# Altium project Flight Controller Core.PrjPcb (part 2 of 2)

## Sheet S7_Uart.SchDoc
size 420 x 297 mm; SheetNumber: 7; SheetTotal: 11
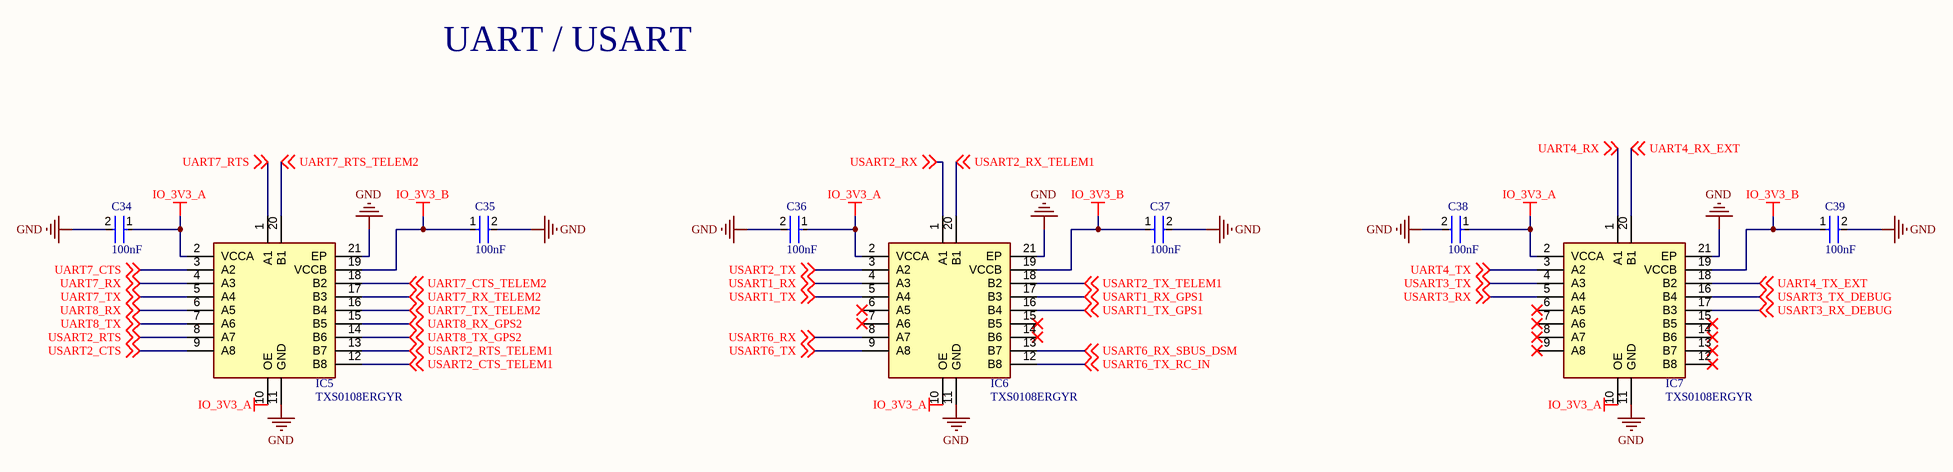
[diagram p6: S7_Uart.SchDoc]

### Parts
C34  100nF  [FP-CC0402-MFG]
C35  100nF  [FP-CC0402-MFG]
C36  100nF  [FP-CC0402-MFG]
C37  100nF  [FP-CC0402-MFG]
C38  100nF  [FP-CC0402-MFG]
C39  100nF  [FP-CC0402-MFG]
IC5  TXS0108ERGYR  [SN74LVC541ARGYR]
IC6  TXS0108ERGYR  [SN74LVC541ARGYR]
IC7  TXS0108ERGYR  [SN74LVC541ARGYR]

### Nets
GND: C34.2 C35.2 C36.2 C37.2 C38.2 C39.2 IC5.11(GND) IC5.21(EP) IC6.11(GND) IC6.21(EP) IC7.11(GND) IC7.21(EP)
IO_3V3_A: C34.1 C36.1 C38.1 IC5.2(VCCA) IC5.10(OE) IC6.2(VCCA) IC6.10(OE) IC7.2(VCCA) IC7.10(OE)
IO_3V3_B: C35.1 C37.1 C39.1 IC5.19(VCCB) IC6.19(VCCB) IC7.19(VCCB)
UART4_RX: IC7.1(A1) ; off-sheet UART4_RX
UART4_RX_EXT: IC7.20(B1) ; off-sheet UART4_RX_EXT
UART4_TX: IC7.3(A2) ; off-sheet UART4_TX
UART4_TX_EXT: IC7.18(B2) ; off-sheet UART4_TX_EXT
UART7_CTS: IC5.3(A2) ; off-sheet UART7_CTS
UART7_CTS_TELEM2: IC5.18(B2) ; off-sheet UART7_CTS_TELEM2
UART7_RTS: IC5.1(A1) ; off-sheet UART7_RTS
UART7_RTS_TELEM2: IC5.20(B1) ; off-sheet UART7_RTS_TELEM2
UART7_RX: IC5.4(A3) ; off-sheet UART7_RX
UART7_RX_TELEM2: IC5.17(B3) ; off-sheet UART7_RX_TELEM2
UART7_TX: IC5.5(A4) ; off-sheet UART7_TX
UART7_TX_TELEM2: IC5.16(B4) ; off-sheet UART7_TX_TELEM2
UART8_RX: IC5.6(A5) ; off-sheet UART8_RX
UART8_RX_GPS2: IC5.15(B5) ; off-sheet UART8_RX_GPS2
UART8_TX: IC5.7(A6) ; off-sheet UART8_TX
UART8_TX_GPS2: IC5.14(B6) ; off-sheet UART8_TX_GPS2
USART1_RX: IC6.4(A3) ; off-sheet USART1_RX
USART1_RX_GPS1: IC6.17(B3) ; off-sheet USART1_RX_GPS1
USART1_TX: IC6.5(A4) ; off-sheet USART1_TX
USART1_TX_GPS1: IC6.16(B4) ; off-sheet USART1_TX_GPS1
USART2_CTS: IC5.9(A8) ; off-sheet USART2_CTS
USART2_CTS_TELEM1: IC5.12(B8) ; off-sheet USART2_CTS_TELEM1
USART2_RTS: IC5.8(A7) ; off-sheet USART2_RTS
USART2_RTS_TELEM1: IC5.13(B7) ; off-sheet USART2_RTS_TELEM1
USART2_RX: IC6.1(A1) ; off-sheet USART2_RX
USART2_RX_TELEM1: IC6.20(B1) ; off-sheet USART2_RX_TELEM1
USART2_TX: IC6.3(A2) ; off-sheet USART2_TX
USART2_TX_TELEM1: IC6.18(B2) ; off-sheet USART2_TX_TELEM1
USART3_RX: IC7.5(A4) ; off-sheet USART3_RX
USART3_RX_DEBUG: IC7.17(B3) ; off-sheet USART3_RX_DEBUG
USART3_TX: IC7.4(A3) ; off-sheet USART3_TX
USART3_TX_DEBUG: IC7.16(B4) ; off-sheet USART3_TX_DEBUG
USART6_RX: IC6.8(A7) ; off-sheet USART6_RX
USART6_RX_SBUS_DSM: IC6.13(B7) ; off-sheet USART6_RX_SBUS_DSM
USART6_TX: IC6.9(A8) ; off-sheet USART6_TX
USART6_TX_RC_IN: IC6.12(B8) ; off-sheet USART6_TX_RC_IN

Not connected (* = marked no-connect by the designer): IC6 6(A5)* 7(A6)* 14(B6)* 15(B5)*; IC7 6(A5)* 7(A6)* 8(A7)* 9(A8)* 12(B8)* 13(B7)* 14(B6)* 15(B5)*

### Notes on the sheet
- UART / USART
- THIS DOCUMENT AND THE DATA DISCLOSED HEREIN OR
- HEREWITH IS THE PROPERTY OF ALTIUM LIMITED AND MAY
- DWG NO:
- REVISION
- REV:
- DESCRIPTION
- DATE
- APPROVED
- BE FREELY DISTRIBUTED IN WHOLE. NO RIGHTS ARE
- RESERVED OR EXPRESS OR IMPLIED WARANTEE GIVEN.
- ENG:
- APPROVALS
- PROJECT
- DSN:
- CHK:
- REFERENCE DOCUMENTS
- PROJECT REVISION:
- TITLE
- DOCUMENT REVISION:
- DESIGN ITEM:
- BOM:
- FAB DWG:
- PCB DWG:
- ASSY DWG:
- SCALE:
- A3
- SIZE
- CAGE CODE
- FILE NAME
- DWG NO.
- SHEET
- OF
- REV

### Library data of the parts
C34-C39 = CMP-03422-001121-1: CAP CER 0.1UF 16V X7R 0402; Manufacturer: YAGEO; Manufacturer Part Number: CC0402KPX7R7BB104; Material: Ceramic; Temperature Coefficient: 30ppm/°C; Automotive Grade: NA; Tolerance: 0.1; Digikey Description: CAP CER 0.1UF 16V X7R 0402; Temperature Range Low: -55°C; Footprint Url: http://www.yageo.com/exep/pages/download/literatures/UPY-C_GEN_24.pdf; RoHS: TRUE; Device Class L3: Ceramic Capacitors; Temperature Characteristic: X7R; Capacitance: 100 nF; Package: CC0402; Device Class L1: Passive Components; Lead Free: Yes; Temperature Range High: +125°C; Category: Cap; Mouser Description: 0402 0.1 uF 16 V ±10% Tolerance X7R SMT Multilayer Ceramic Capacitor; Voltage Rating: 16 V; Value: 100 nF; ComponentLink2Description: Datasheet; Automotive: No; Octopart: https://octopart.com/cc0402kpx7r7bb104-yageo-21548559; ComponentLink2URL: http://www.yageo.com/documents/recent/UPY-GP_NP0_16V-to-50V_16.pdf; Height: 0.55mm; Device Class L2: Capacitors; Temperature: -55°C to +125°C; Ipc Land Pattern Name: CAPC10050X50
IC5-IC7 = TXS0108ERGYR: Integrated Circuit; Manufacturer_Name: Texas Instruments; Datasheet Link: http://www.ti.com/lit/gpn/txs0108e; Height: 1mm; Manufacturer_Part_Number: TXS0108ERGYR; Mouser Part Number: 595-TXS0108ERGYR; Mouser Price/Stock: https://www.mouser.co.uk/ProductDetail/Texas-Instruments/TXS0108ERGYR?qs=dqESbKqT1jau1kZv8JPj9Q%3D%3D; Arrow Part Number: TXS0108ERGYR; Arrow Price/Stock: https://www.arrow.com/en/products/txs0108ergyr/texas-instruments?utm_currency=USD&region=nac

## Sheet S8_Usb_Select.SchDoc
size 420 x 297 mm; SheetNumber: 8; SheetTotal: 11
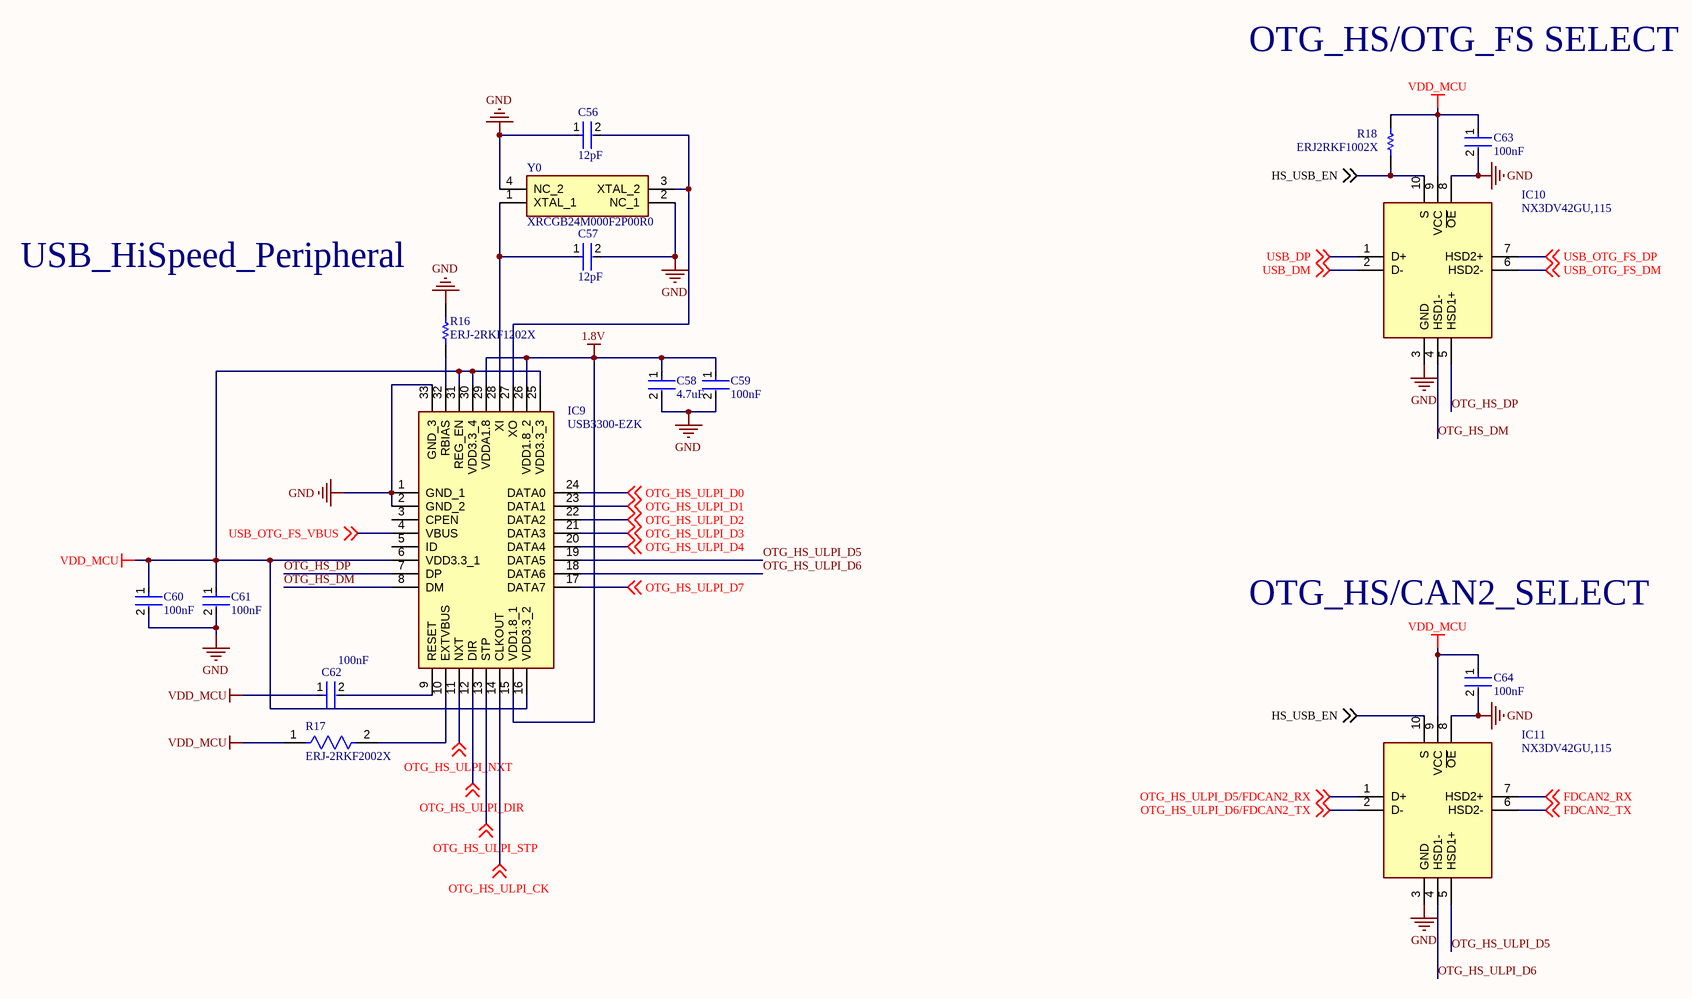
[diagram p7: S8_Usb_Select.SchDoc]

### Parts
C56  12pF  [FP-GRM155-0_05-MFG]
C57  12pF  [FP-GRM155-0_05-MFG]
C58  4.7uF  [FP-CC0402-MFG]
C59  100nF  [FP-CC0402-MFG]
C60  100nF  [FP-CC0402-MFG]
C61  100nF  [FP-CC0402-MFG]
C62  100nF  [FP-CC0402-MFG]
C63  100nF  [FP-CC0402-MFG]
C64  100nF  [FP-CC0402-MFG]
IC9  USB3300-EZK  [QFN50P500X500X100-33N-D]
IC10  NX3DV42GU,115  [QFN40P140X180X50-10N]
IC11  NX3DV42GU,115  [QFN40P140X180X50-10N]
R16  ERJ-2RKF1202X  [RESC1005X40X25ML05T05]
R17  ERJ-2RKF2002X  [FP-ERJ2RK-MFG]
R18  ERJ2RKF1002X  [RESC1005X40X25LL05T05]
Y0  XRCGB24M000F2P00R0  [XRCGB]

### Nets
1.8V: C58.1 C59.1 IC9.15(VDD1.8_1) IC9.26(VDD1.8_2) IC9.29(VDDA1.8)
GND: C56.1 C57.2 C58.2 C59.2 C60.2 C61.2 C63.2 C64.2 IC9.1(GND_1) IC9.2(GND_2) IC9.33(GND_3) IC10.3(GND) IC10.8(~{OE}) IC11.3(GND) IC11.8(~{OE}) R16.2 Y0.2(NC_1) Y0.4(NC_2)
VDD_MCU: C60.1 C61.1 C62.1 C63.1 C64.1 IC9.6(VDD3.3_1) IC9.16(VDD3.3_2) IC9.25(VDD3.3_3) IC9.30(VDD3.3_4) IC9.31(REG_EN) IC10.9(VCC) IC11.9(VCC) R17.1 R18.2
FDCAN2_RX: IC11.7(HSD2+) ; off-sheet FDCAN2_RX
FDCAN2_TX: IC11.6(HSD2-) ; off-sheet FDCAN2_TX
HS_USB_EN: IC10.10(S) IC11.10(S) R18.1 ; off-sheet HS_USB_EN
OTG_HS_DM: IC9.8(DM) IC10.4(HSD1-)
OTG_HS_DP: IC9.7(DP) IC10.5(HSD1+)
OTG_HS_ULPI_CK: IC9.14(CLKOUT) ; off-sheet OTG_HS_ULPI_CK
OTG_HS_ULPI_D0: IC9.24(DATA0) ; off-sheet OTG_HS_ULPI_D0
OTG_HS_ULPI_D1: IC9.23(DATA1) ; off-sheet OTG_HS_ULPI_D1
OTG_HS_ULPI_D2: IC9.22(DATA2) ; off-sheet OTG_HS_ULPI_D2
OTG_HS_ULPI_D3: IC9.21(DATA3) ; off-sheet OTG_HS_ULPI_D3
OTG_HS_ULPI_D4: IC9.20(DATA4) ; off-sheet OTG_HS_ULPI_D4
OTG_HS_ULPI_D5: IC9.19(DATA5) IC11.5(HSD1+)
OTG_HS_ULPI_D5/FDCAN2_RX: IC11.1(D+) ; off-sheet OTG_HS_ULPI_D5/FDCAN2_RX
OTG_HS_ULPI_D6: IC9.18(DATA6) IC11.4(HSD1-)
OTG_HS_ULPI_D6/FDCAN2_TX: IC11.2(D-) ; off-sheet OTG_HS_ULPI_D6/FDCAN2_TX
OTG_HS_ULPI_D7: IC9.17(DATA7) ; off-sheet OTG_HS_ULPI_D7
OTG_HS_ULPI_DIR: IC9.12(DIR) ; off-sheet OTG_HS_ULPI_DIR
OTG_HS_ULPI_NXT: IC9.11(NXT) ; off-sheet OTG_HS_ULPI_NXT
OTG_HS_ULPI_STP: IC9.13(STP) ; off-sheet OTG_HS_ULPI_STP
USB_DM: IC10.2(D-) ; off-sheet USB_DM
USB_DP: IC10.1(D+) ; off-sheet USB_DP
USB_OTG_FS_DM: IC10.6(HSD2-) ; off-sheet USB_OTG_FS_DM
USB_OTG_FS_DP: IC10.7(HSD2+) ; off-sheet USB_OTG_FS_DP
USB_OTG_FS_VBUS: IC9.4(VBUS) ; off-sheet USB_OTG_FS_VBUS
NetC56_2: C56.2 IC9.27(XO) Y0.3(XTAL_2)
NetC57_1: C57.1 IC9.28(XI) Y0.1(XTAL_1)
NetC62_2: C62.2 IC9.9(RESET)
NetIC9_10: IC9.10(EXTVBUS) R17.2
NetIC9_32: IC9.32(RBIAS) R16.1

Not connected (* = marked no-connect by the designer): IC9 3(CPEN) 5(ID)

### Notes on the sheet
- OTG_HS/OTG_FS SELECT
- (near R16) USB_HiSpeed_Peripheral
- OTG_HS/CAN2_SELECT
- THIS DOCUMENT AND THE DATA DISCLOSED HEREIN OR
- HEREWITH IS THE PROPERTY OF ALTIUM LIMITED AND MAY
- DWG NO:
- REVISION
- REV:
- DESCRIPTION
- DATE
- APPROVED
- BE FREELY DISTRIBUTED IN WHOLE. NO RIGHTS ARE
- RESERVED OR EXPRESS OR IMPLIED WARANTEE GIVEN.
- ENG:
- APPROVALS
- PROJECT
- DSN:
- CHK:
- REFERENCE DOCUMENTS
- PROJECT REVISION:
- TITLE
- DOCUMENT REVISION:
- DESIGN ITEM:
- BOM:
- FAB DWG:
- PCB DWG:
- ASSY DWG:
- SCALE:
- A3
- SIZE
- CAGE CODE
- FILE NAME
- DWG NO.
- SHEET
- OF
- REV

### Library data of the parts
C56 C57 = CMP-2008-03945-2: CAP CER 12PF 50V C0G/NP0 0402; Tolerance: 2%; Dielectric: C0G; Material: Ceramic; Termination: SMD/SMT; Mount: Surface Mount; REACH SVHC: No SVHC; Depth: 0.5mm; Case Code (Metric): 1005; Voltage Rating: 50V; Height: 0.5mm; Voltage Rating (DC): 50V; Case Code (Imperial): 0402; Package Quantity: 10000; Construction: Flat; Thickness: 0.022inch; Length: 1mm; Min Operating Temperature: -55°C; Width: 0.5mm; Lead Free: Lead Free; Capacitance: 12pF; Case/Package: 0402; Packaging: Tape and Reel; Series: GRM; Voltage: 50V; Radiation Hardening: No; Max Operating Temperature: 125°C
C58 = CMP-1034-02137-2: CAP CER 4.7UF 6.3V X5R 0402; Manufacturer: YAGEO; Manufacturer Part Number: CC0402MRX5R5BB475; Temperature Coefficient: 30ppm/°C; Tolerance: 0.2; Automotive Grade: NA; Material: Ceramic; Automotive: No; Temperature: -55°C to +125°C; Category: Cap; Ipc Land Pattern Name: CAPC10050X50; Digikey Description: CAP CER 4.7UF 6.3V X5R 0402; ComponentLink2Description: Datasheet; Octopart: https://octopart.com/cc0402mrx5r5bb475-yageo-20021081; Mouser Description: Multilayer Ceramic Capacitors MLCC - SMD/SMT 4.7uF 6.3V X5R 20%; Device Class L1: Passive Components; Footprint Url: http://www.yageo.com/exep/pages/download/literatures/UPY-C_GEN_24.pdf; Value: 4.7 uF; Temperature Range High: +125°C; ComponentLink2URL: http://www.yageo.com/documents/recent/UPY-GP_NP0_16V-to-50V_16.pdf; Voltage Rating: 6.3 V; Height: 0.55mm; RoHS: TRUE; Package: CC0402; Device Class L3: Ceramic Capacitors; Temperature Characteristic: X5R; Temperature Range Low: -55°C; Capacitance: 4.7 uF; Device Class L2: Capacitors; Lead Free: Yes
C59-C64 = CMP-03422-001121-1: as C34 on sheet S7_Uart; Digikey Description: CAP CER 0.1UF 16V X7R 0402; Temperature Range Low: -55°C; Footprint Url: http://www.yageo.com/exep/pages/download/literatures/UPY-C_GEN_24.pdf; RoHS: TRUE; Device Class L3: Ceramic Capacitors; Temperature Characteristic: X7R; Capacitance: 100 nF; Package: CC0402; Device Class L1: Passive Components; Lead Free: Yes; Temperature Range High: +125°C; Category: Cap; Mouser Description: 0402 0.1 uF 16 V ±10% Tolerance X7R SMT Multilayer Ceramic Capacitor; Voltage Rating: 16 V; Value: 100 nF; ComponentLink2Description: Datasheet; Automotive: No; Octopart: https://octopart.com/cc0402kpx7r7bb104-yageo-21548559; ComponentLink2URL: http://www.yageo.com/documents/recent/UPY-GP_NP0_16V-to-50V_16.pdf; Height: 0.55mm; Device Class L2: Capacitors; Temperature: -55°C to +125°C; Ipc Land Pattern Name: CAPC10050X50
IC9 = USB3300-EZK: Integrated Circuit; Manufacturer_Name: Microchip; Datasheet Link: http://www.microchip.com/mymicrochip/filehandler.aspx?ddocname=en562663; Height: 1mm; Manufacturer_Part_Number: USB3300-EZK; Mouser Part Number: 886-USB3300-EZK; Mouser Price/Stock: https://www.mouser.co.uk/ProductDetail/Microchip-Technology/USB3300-EZK?qs=pA5MXup5wxFkdKvPjm4n2w%3D%3D; Arrow Part Number: USB3300-EZK; Arrow Price/Stock: https://www.arrow.com/en/products/usb3300-ezk/microchip-technology?region=europe
IC10 IC11 = NX3DV42GU,115: Integrated Circuit; Manufacturer_Name: NXP; Datasheet Link: http://www.nxp.com/docs/en/data-sheet/NX3DV42.pdf; Height: 0.5mm; Manufacturer_Part_Number: NX3DV42GU,115; Mouser Part Number: 771-NX3DV42GU115; Mouser Price/Stock: https://www.mouser.co.uk/ProductDetail/NXP-Semiconductors/NX3DV42GU115?qs=cbprxTG2Yq%252BinzuyAklGVQ%3D%3D; Arrow Part Number: NX3DV42GU,115; Arrow Price/Stock: https://www.arrow.com/en/products/nx3dv42gu115/nxp-semiconductors?region=nac
R16 = CMP-2002-00646-4: Chip Resistor, 12 KOhm, +/- 1%, 0.1 W, -55 to 155 degC, 0402 (1005 Metric), RoHS, Tape and Reel; Resistance: 12 KOhm; Voltage Rating: 50 V; Case\/Package: 0402; Power Rating: 100 mW; Length: 1 mm; PackageReference: 0402; DatasheetVersion: 04/2015; ComponentLink2Description: Datasheet; ComponentLink1URL: http://www.panasonic.com/; Pins: 2; Width: 0.5 mm; REACH SVHC: Yes; Packaging: Tape and Reel; Min Operating Temperature: -55 degC; Mounting Technology: Surface Mount; Max Operating Temperature: 155 degC; Case Code (Imperial): 0402; Height: 0.35 mm; Tolerance: 1%; PackageDescription: 2-Pin Surface Mount Device, Body 1 x 0.5 mm; RoHSCompliant: true; ComponentLink1Description: Manufacturer URL; Mount: Surface Mount; ComponentLink2URL: http://industrial.panasonic.com/cdbs/www-data/pdf/RDA0000/AOA0000C86.pdf; Package Quantity: 10000; Case Code (Metric): 1005; PartNumber: ERJ-2RKF1202X
R17 = CMP-2002-00759-4: RES SMD 20K OHM 1% 1/10W 0402; Resistance: 20kR; Voltage Rating (DC): 50V; Power Rating: 100mW; Temperature Coefficient: 100ppm/°C; Radiation Hardening: No; Case/Package: 0402; Case Code (Metric): 1005; Min Operating Temperature: -55°C; Termination: SMD/SMT; Package Quantity: 1; Length: 1mm; Case Code (Imperial): 0402; Lead Free: Lead Free; Height: 0.35mm; Max Operating Temperature: 155°C; Depth: 0.5mm; Number of Terminations: 2; Military Standard: Not; Max Power Dissipation: 100mW; Tolerance: 1%; Composition: Thick Film; Weight: 2.8E-05oz; Features: Automotive AEC-Q200; Voltage Rating: 50V; Contact Plating: Tin; REACH SVHC: No SVHC; Width: 0.02inch; Packaging: Cut Tape; Mount: Surface Mount
R18 = CMP-2000-07588-1: Chip Resistor, 10 KOhm, +/- 1%, 0.1 W, -55 to 155 degC, 0402 (1005 Metric), RoHS, Tape and Reel; Manufacturer: Panasonic; Power Rating: 100mW; Voltage Rating: 50V; Resistance: 10KOhm; Case\/Package: 0402; Temperature Coefficient: 100ppm\/degreesC; RoHSCompliant: True; Lead Free: LeadFree; Package Quantity: 1; Contact Plating: Tin; Length: 1mm; Radiation Hardening: No; REACH SVHC: NoSVHC; Max Operating Temperature: 155degC; Depth: 0.5mm; Case Code (Imperial): 0402; Military Standard: Not; Package Description: 2-Pin Surface Mount Device, Body 1 x 0.5 mm; Termination: SMD/SMT; Case Code (Metric): 1005; Height: 0.35mm; Packaging: TapeandReel; Voltage Rating (DC): 50V; Package Reference: 402; Number of Pins: 2; Tolerance: 1%; Mounting Technology: SurfaceMount; Width: 0.02inch; Mount: SurfaceMount; Datasheet URL: https://industrial.panasonic.com/cdbs/www-data/pdf/RDA0000/AOA0000C304.pdf; Composition: ThickFilm; Datasheet Version: 02/2017; Manufacturer URL: http://www.panasonic.com/; Max Power Dissipation: 100mW; Number of Terminations: 2; Min Operating Temperature: -55degC
Y0 = XRCGB24M000F2P00R0: Crystal or Oscillator; Manufacturer_Name: Murata Electronics; Datasheet Link: https://www.murata.com/products/productdata/8801057734686/SPEC-XRCGB24M000F2P00R0.pdf; Height: 0.7mm; Manufacturer_Part_Number: XRCGB24M000F2P00R0; Mouser Part Number: 81-XRCGB24M000F2P0R0; Mouser Price/Stock: https://www.mouser.co.uk/ProductDetail/Murata-Electronics/XRCGB24M000F2P00R0?qs=gvhpkjpQEVQGHd411wA%252BwA%3D%3D; Arrow Part Number: XRCGB24M000F2P00R0; Arrow Price/Stock: https://www.arrow.com/en/products/xrcgb24m000f2p00r0/murata-manufacturing?region=nac

## Sheet S9_Can.SchDoc
size 420 x 297 mm; SheetNumber: 9; SheetTotal: 11
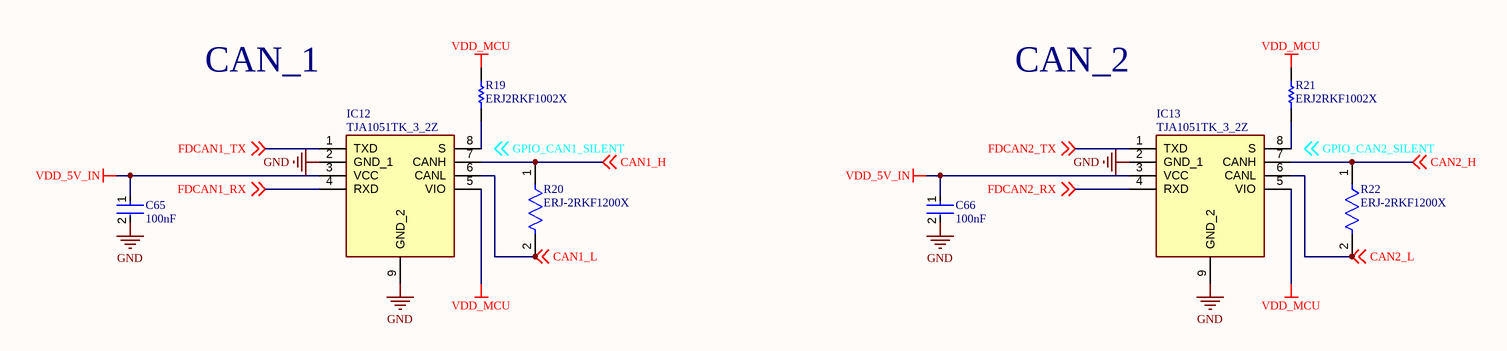
[diagram p8: S9_Can.SchDoc]

### Parts
C65  100nF  [FP-CC0402-MFG]
C66  100nF  [FP-CC0402-MFG]
IC12  TJA1051TK_3_2Z  [SON65P300X300X100-9N-D]
IC13  TJA1051TK_3_2Z  [SON65P300X300X100-9N-D]
R19  ERJ2RKF1002X  [RESC1005X40X25LL05T05]
R20  ERJ-2RKF1200X  [FP-ERJ2RK-MFG]
R21  ERJ2RKF1002X  [RESC1005X40X25LL05T05]
R22  ERJ-2RKF1200X  [FP-ERJ2RK-MFG]

### Nets
GND: C65.2 C66.2 IC12.2(GND_1) IC12.9(GND_2) IC13.2(GND_1) IC13.9(GND_2)
VDD_5V_IN: C65.1 C66.1 IC12.3(VCC) IC13.3(VCC)
VDD_MCU: IC12.5(VIO) IC13.5(VIO) R19.2 R21.2
CAN1_H: IC12.7(CANH) R20.1 ; off-sheet CAN1_H
CAN1_L: IC12.6(CANL) R20.2 ; off-sheet CAN1_L
CAN2_H: IC13.7(CANH) R22.1 ; off-sheet CAN2_H
CAN2_L: IC13.6(CANL) R22.2 ; off-sheet CAN2_L
FDCAN1_RX: IC12.4(RXD) ; off-sheet FDCAN1_RX
FDCAN1_TX: IC12.1(TXD) ; off-sheet FDCAN1_TX
FDCAN2_RX: IC13.4(RXD) ; off-sheet FDCAN2_RX
FDCAN2_TX: IC13.1(TXD) ; off-sheet FDCAN2_TX
NetIC12_8: IC12.8(S) R19.1
NetIC13_8: IC13.8(S) R21.1

### Notes on the sheet
- CAN_1
- CAN_2
- Labels drawn without touching a wire or pin: GPIO_CAN1_SILENT, GPIO_CAN2_SILENT
- THIS DOCUMENT AND THE DATA DISCLOSED HEREIN OR
- HEREWITH IS THE PROPERTY OF ALTIUM LIMITED AND MAY
- DWG NO:
- REVISION
- REV:
- DESCRIPTION
- DATE
- APPROVED
- BE FREELY DISTRIBUTED IN WHOLE. NO RIGHTS ARE
- RESERVED OR EXPRESS OR IMPLIED WARANTEE GIVEN.
- ENG:
- APPROVALS
- PROJECT
- DSN:
- CHK:
- REFERENCE DOCUMENTS
- PROJECT REVISION:
- TITLE
- DOCUMENT REVISION:
- DESIGN ITEM:
- BOM:
- FAB DWG:
- PCB DWG:
- ASSY DWG:
- SCALE:
- A3
- SIZE
- CAGE CODE
- FILE NAME
- DWG NO.
- SHEET
- OF
- REV

### Library data of the parts
C65 C66 = CMP-03422-001121-1: as C34 on sheet S7_Uart; Digikey Description: CAP CER 0.1UF 16V X7R 0402; Temperature Range Low: -55°C; Footprint Url: http://www.yageo.com/exep/pages/download/literatures/UPY-C_GEN_24.pdf; RoHS: TRUE; Device Class L3: Ceramic Capacitors; Temperature Characteristic: X7R; Capacitance: 100 nF; Package: CC0402; Device Class L1: Passive Components; Lead Free: Yes; Temperature Range High: +125°C; Category: Cap; Mouser Description: 0402 0.1 uF 16 V ±10% Tolerance X7R SMT Multilayer Ceramic Capacitor; Voltage Rating: 16 V; Value: 100 nF; ComponentLink2Description: Datasheet; Automotive: No; Octopart: https://octopart.com/cc0402kpx7r7bb104-yageo-21548559; ComponentLink2URL: http://www.yageo.com/documents/recent/UPY-GP_NP0_16V-to-50V_16.pdf; Height: 0.55mm; Device Class L2: Capacitors; Temperature: -55°C to +125°C; Ipc Land Pattern Name: CAPC10050X50
IC12 IC13 = TJA1051TK_3: Integrated Circuit; Manufacturer_Name: NXP; Manufacturer_Part_Number: TJA1051TK/3; Datasheet Link: https://www.nxp.com/docs/en/data-sheet/TJA1051.pdf; Height: 1mm; Mouser Part Number: N/A; Mouser Price/Stock: https://www.mouser.co.uk/ProductDetail/NXP-Semiconductors/TJA1051TK-3?qs=fAHHVMwC%252BbjHKozSeK7tBA%3D%3D
R19 R21 = CMP-2000-07588-1: as R18 on sheet S8_Usb_Select; RoHSCompliant: True; Lead Free: LeadFree; Package Quantity: 1; Contact Plating: Tin; Length: 1mm; Radiation Hardening: No; REACH SVHC: NoSVHC; Max Operating Temperature: 155degC; Depth: 0.5mm; Case Code (Imperial): 0402; Military Standard: Not; Package Description: 2-Pin Surface Mount Device, Body 1 x 0.5 mm; Termination: SMD/SMT; Case Code (Metric): 1005; Height: 0.35mm; Packaging: TapeandReel; Voltage Rating (DC): 50V; Package Reference: 402; Number of Pins: 2; Tolerance: 1%; Mounting Technology: SurfaceMount; Width: 0.02inch; Mount: SurfaceMount; Datasheet URL: https://industrial.panasonic.com/cdbs/www-data/pdf/RDA0000/AOA0000C304.pdf; Composition: ThickFilm; Datasheet Version: 02/2017; Manufacturer URL: http://www.panasonic.com/; Max Power Dissipation: 100mW; Number of Terminations: 2; Min Operating Temperature: -55degC
R20 R22 = CMP-2002-00645-2: RES SMD 120 OHM 1% 1/10W 0402; Resistance: 120R; Voltage Rating (DC): 50V; Temperature Coefficient: 100ppm/°C; Power Rating: 100mW; Case Code (Imperial): 0402; Military Standard: Not; Width: 0.5mm; Technology: THICK FILM; Case Code (Metric): 1005; Lead Free: Lead Free; Radiation Hardening: No; Termination: SMD/SMT; Weight: 0.000388oz; Case/Package: 0402; Resistor Type: Thick Film; Number of Pins: 2; Package Quantity: 10000; Tolerance: 1%; Depth: 0.5mm; RoHS Compliant: Yes; Min Operating Temperature: -55°C; Max Operating Temperature: 155°C; Length: 1mm; Series: ERJ-2Rx; Height: 0.35mm; Mount: Surface Mount; Number of Terminations: 2; Features: Automotive AEC-Q200; Contact Plating: Tin; Voltage Rating: 50V; Max Power Dissipation: 100mW; Packaging: Cut Tape; REACH SVHC: No SVHC

## Sheet S10_Adc.SchDoc
size 420 x 297 mm; SheetNumber: 10; SheetTotal: 12
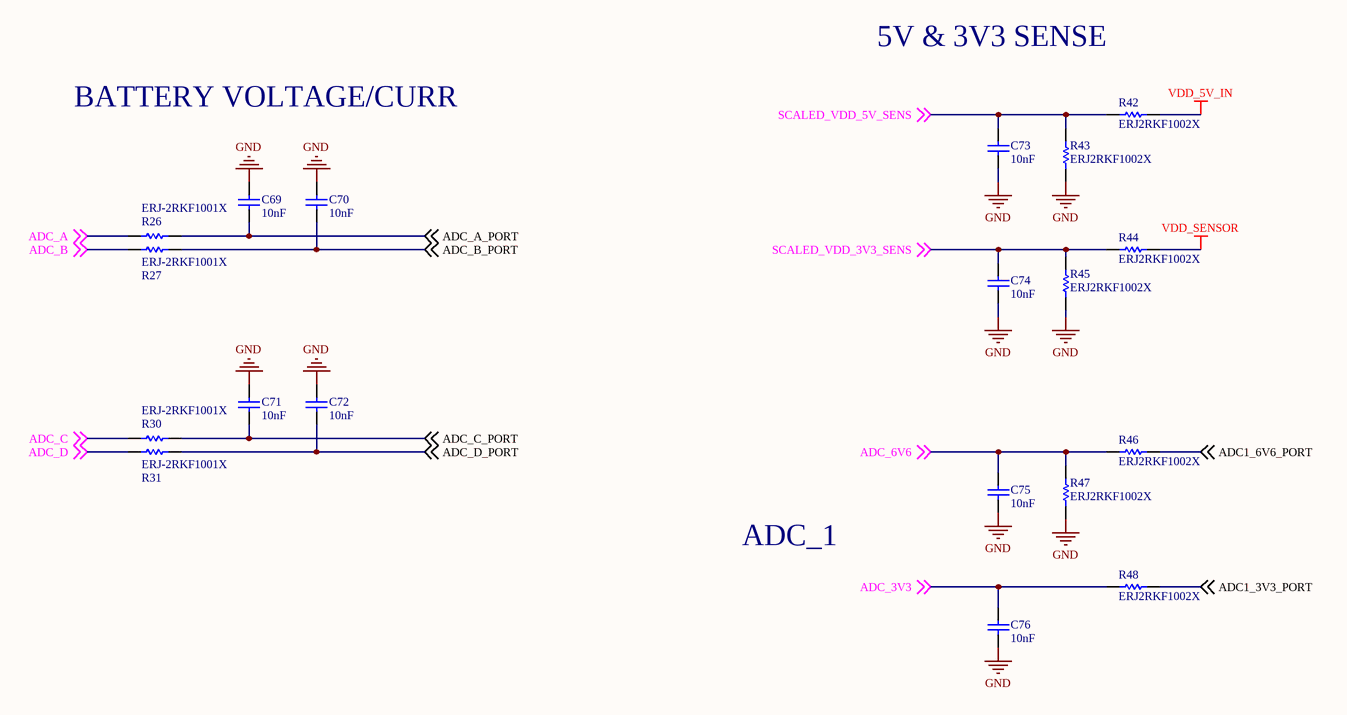
[diagram p9: S10_Adc.SchDoc]

### Parts
C69  10nF  [CAPC1005X55X25LL05T10]
C70  10nF  [CAPC1005X55X25LL05T10]
C71  10nF  [CAPC1005X55X25LL05T10]
C72  10nF  [CAPC1005X55X25LL05T10]
C73  10nF  [CAPC1005X55X25LL05T10]
C74  10nF  [CAPC1005X55X25LL05T10]
C75  10nF  [CAPC1005X55X25LL05T10]
C76  10nF  [CAPC1005X55X25LL05T10]
R26  ERJ-2RKF1001X  [RESC1005X40X25NL05T05]
R27  ERJ-2RKF1001X  [RESC1005X40X25NL05T05]
R30  ERJ-2RKF1001X  [RESC1005X40X25NL05T05]
R31  ERJ-2RKF1001X  [RESC1005X40X25NL05T05]
R42  ERJ2RKF1002X  [RESC1005X40X25LL05T05]
R43  ERJ2RKF1002X  [RESC1005X40X25LL05T05]
R44  ERJ2RKF1002X  [RESC1005X40X25LL05T05]
R45  ERJ2RKF1002X  [RESC1005X40X25LL05T05]
R46  ERJ2RKF1002X  [RESC1005X40X25LL05T05]
R47  ERJ2RKF1002X  [RESC1005X40X25LL05T05]
R48  ERJ2RKF1002X  [RESC1005X40X25LL05T05]

### Nets
GND: C69.2 C70.2 C71.2 C72.2 C73.1 C74.1 C75.1 C76.1 R43.1 R45.1 R47.1
VDD_5V_IN: R42.2
VDD_SENSOR: R44.2
ADC1_3V3_PORT: R48.2 ; off-sheet ADC1_3V3_PORT
ADC1_6V6_PORT: R46.2 ; off-sheet ADC1_6V6_PORT
ADC_3V3: C76.2 R48.1 ; off-sheet ADC_3V3
ADC_6V6: C75.2 R46.1 R47.2 ; off-sheet ADC_6V6
ADC_A: R26.1 ; off-sheet ADC_A
ADC_A_PORT: C69.1 R26.2 ; off-sheet ADC_A_PORT
ADC_B: R27.1 ; off-sheet ADC_B
ADC_B_PORT: C70.1 R27.2 ; off-sheet ADC_B_PORT
ADC_C: R30.1 ; off-sheet ADC_C
ADC_C_PORT: C71.1 R30.2 ; off-sheet ADC_C_PORT
ADC_D: R31.1 ; off-sheet ADC_D
ADC_D_PORT: C72.1 R31.2 ; off-sheet ADC_D_PORT
SCALED_VDD_3V3_SENS: C74.2 R44.1 R45.2 ; off-sheet SCALED_VDD_3V3_SENS
SCALED_VDD_5V_SENS: C73.2 R42.1 R43.2 ; off-sheet SCALED_VDD_5V_SENS

### Notes on the sheet
- 5V & 3V3 SENSE
- BATTERY VOLTAGE/CURR
- ADC_1
- THIS DOCUMENT AND THE DATA DISCLOSED HEREIN OR
- HEREWITH IS THE PROPERTY OF ALTIUM LIMITED AND MAY
- DWG NO:
- REVISION
- REV:
- DESCRIPTION
- DATE
- APPROVED
- BE FREELY DISTRIBUTED IN WHOLE. NO RIGHTS ARE
- RESERVED OR EXPRESS OR IMPLIED WARANTEE GIVEN.
- ENG:
- APPROVALS
- PROJECT
- DSN:
- CHK:
- REFERENCE DOCUMENTS
- PROJECT REVISION:
- TITLE
- DOCUMENT REVISION:
- DESIGN ITEM:
- BOM:
- FAB DWG:
- PCB DWG:
- ASSY DWG:
- SCALE:
- A3
- SIZE
- CAGE CODE
- FILE NAME
- DWG NO.
- SHEET
- OF
- REV

### Library data of the parts
C69-C76 = CMP-1034-01880-2: Manufacturer: Murata; Part Number: GRM155R71E103KA01D
R26 R27 R30 R31 = CMP-1011-00510-4: Chip Resistor, 1 KOhm, +/- 1%, 100 mW, -55 to 155 degC, 0402 (1005 Metric), RoHS, Tape and Reel; Manufacturer: Basic Passives; Voltage Rating: 50 V; Case\/Package: 0402; Resistance: 1 KOhm; Power Rating: 100 mW; PartNumber: ERJ-2RKF1001X; DatasheetVersion: 04/2015; Radiation Hardening: No; Pins: 2; Height: 0.35 mm; RoHSCompliant: true; Case Code (Imperial): 0402; ComponentLink2Description: Datasheet; ComponentLink1Description: Manufacturer URL; PackageReference: 0402; Mount: Surface Mount; Package Quantity: 10000; Tolerance: 1%; ComponentLink1URL: http://www.panasonic.com/; PackageDescription: 2-Pin Surface Mount Device, Body 1 x 0.5 mm; Mounting Technology: Surface Mount; Case Code (Metric): 1005; ComponentLink2URL: http://industrial.panasonic.com/cdbs/www-data/pdf/RDA0000/AOA0000C86.pdf; REACH SVHC: Yes; Packaging: Tape and Reel; Max Operating Temperature: 155 degC; Min Operating Temperature: -55 degC; Width: 0.5 mm; Length: 1 mm
R42-R48 = CMP-2000-07588-1: as R18 on sheet S8_Usb_Select; RoHSCompliant: True; Lead Free: LeadFree; Package Quantity: 1; Contact Plating: Tin; Length: 1mm; Radiation Hardening: No; REACH SVHC: NoSVHC; Max Operating Temperature: 155degC; Depth: 0.5mm; Case Code (Imperial): 0402; Military Standard: Not; Package Description: 2-Pin Surface Mount Device, Body 1 x 0.5 mm; Termination: SMD/SMT; Case Code (Metric): 1005; Height: 0.35mm; Packaging: TapeandReel; Voltage Rating (DC): 50V; Package Reference: 402; Number of Pins: 2; Tolerance: 1%; Mounting Technology: SurfaceMount; Width: 0.02inch; Mount: SurfaceMount; Datasheet URL: https://industrial.panasonic.com/cdbs/www-data/pdf/RDA0000/AOA0000C304.pdf; Composition: ThickFilm; Datasheet Version: 02/2017; Manufacturer URL: http://www.panasonic.com/; Max Power Dissipation: 100mW; Number of Terminations: 2; Min Operating Temperature: -55degC

## Sheet S11_Busses.SchDoc
size 420 x 297 mm; SheetNumber: 11; SheetTotal: 11
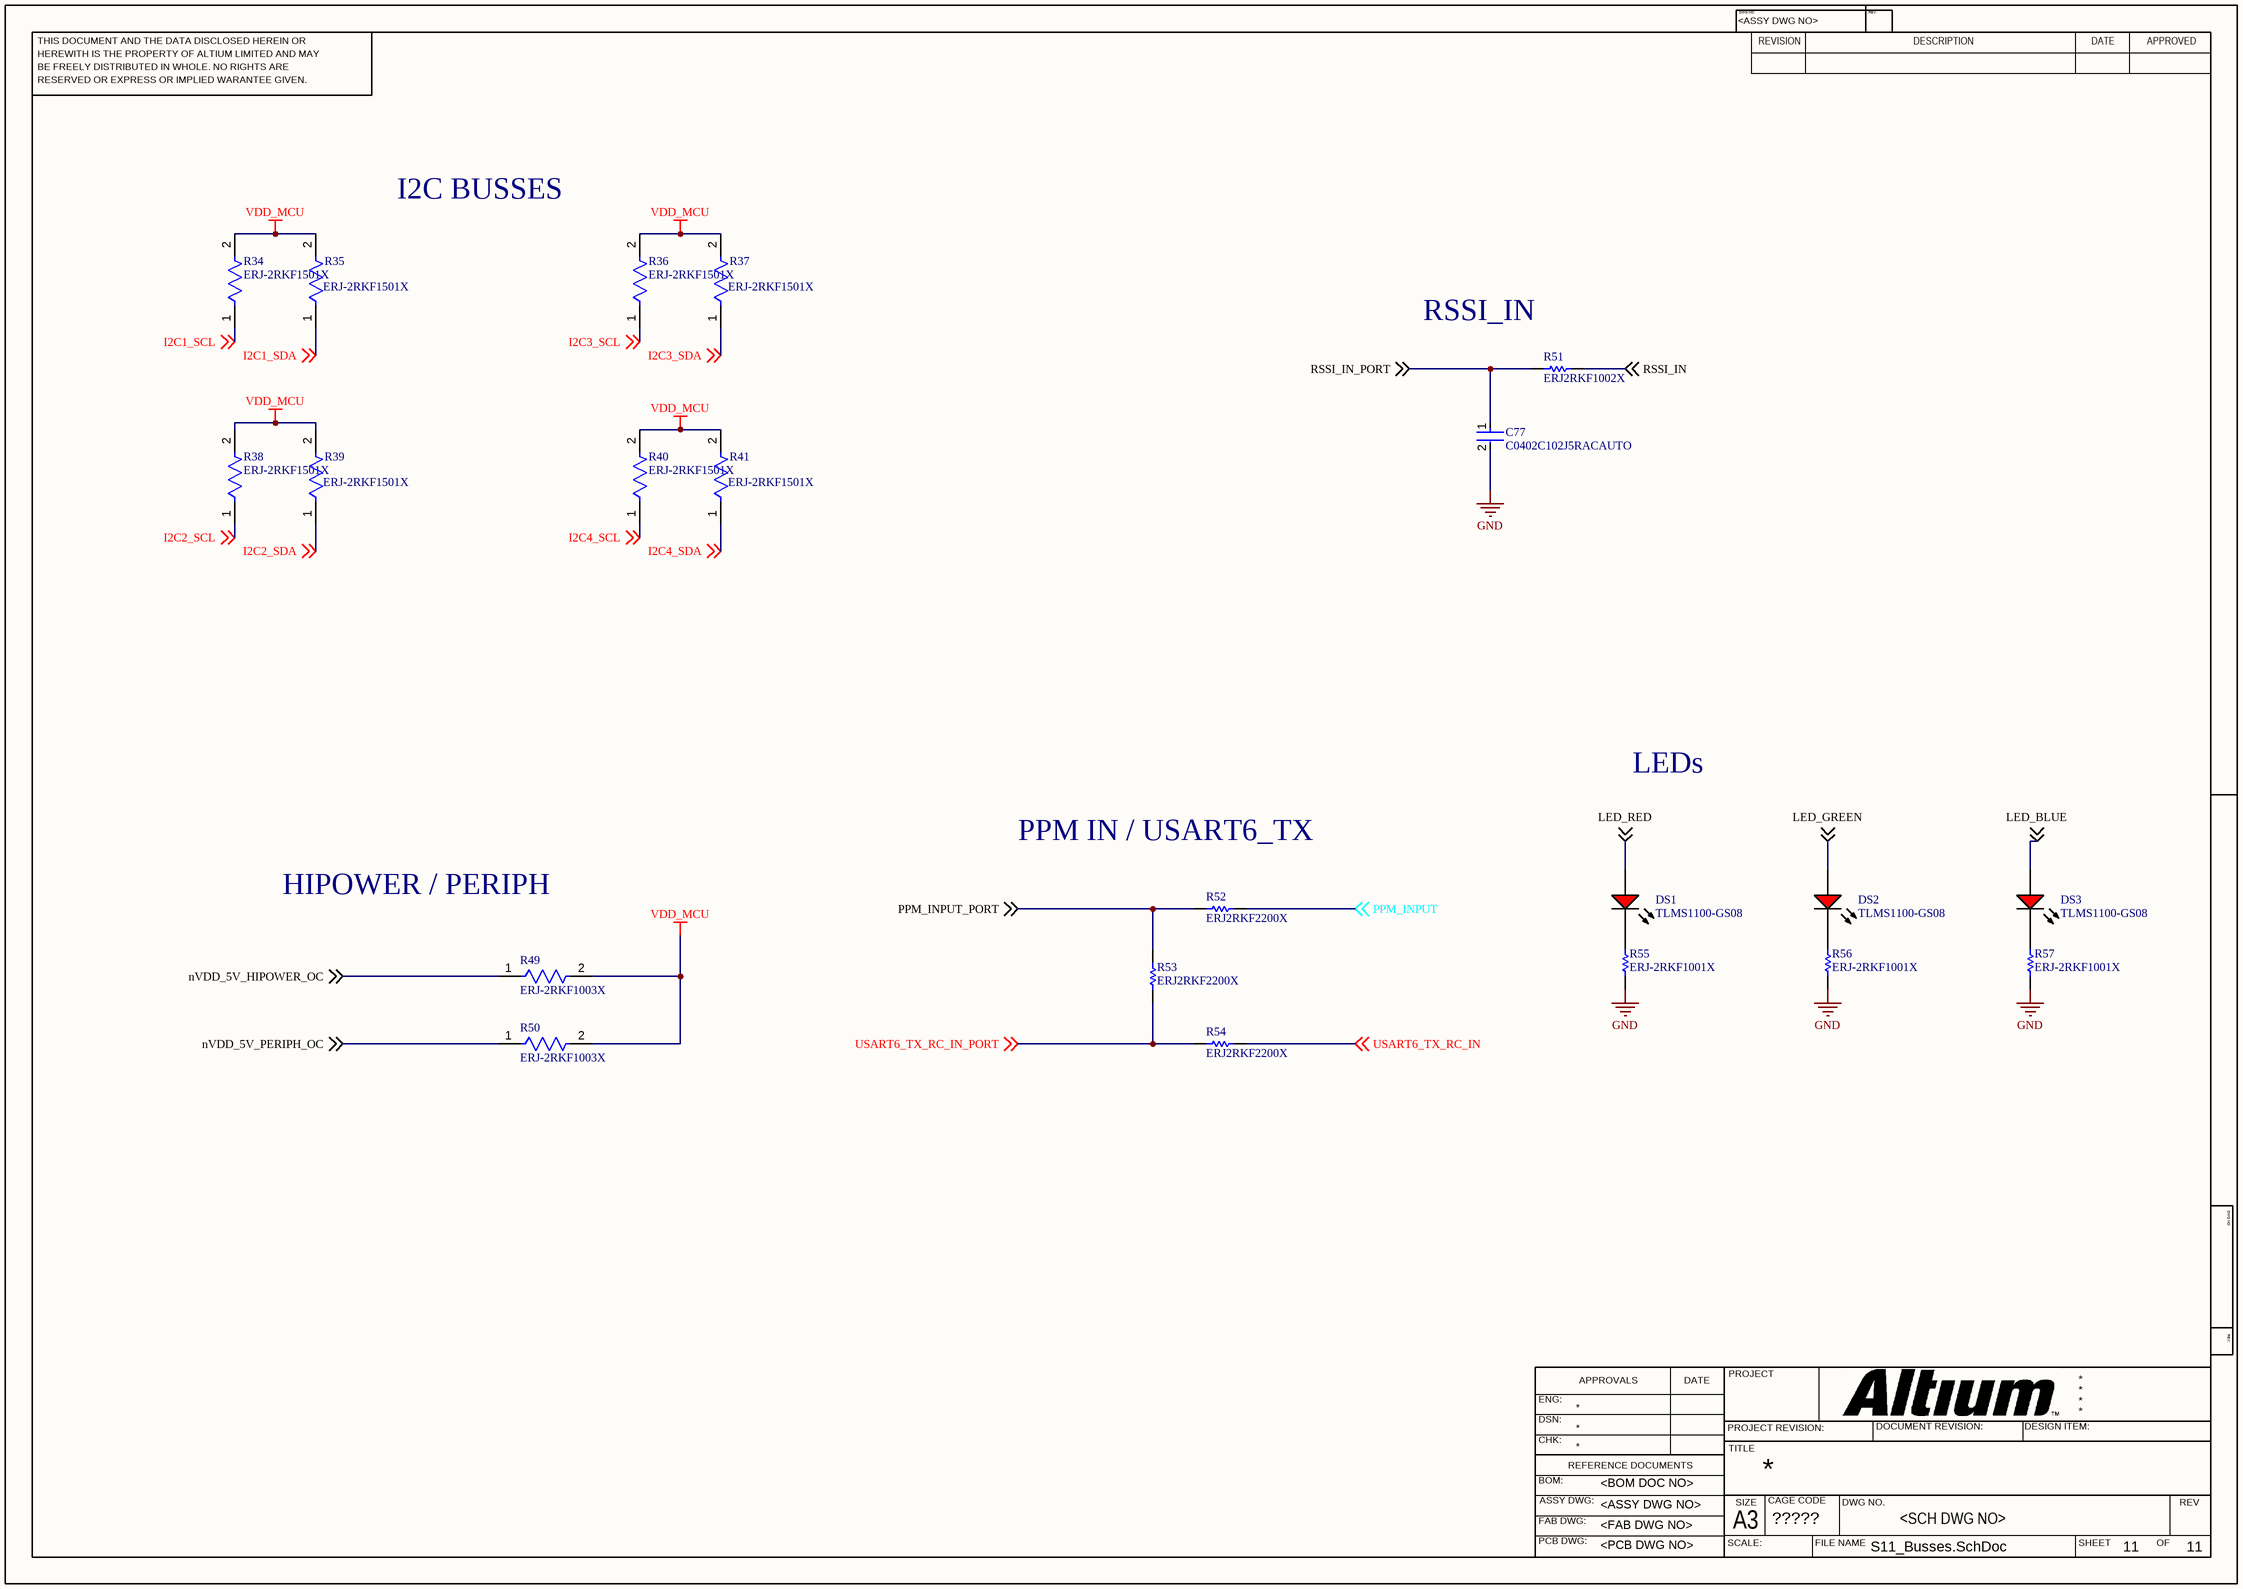
[diagram p10: S11_Busses.SchDoc]

### Parts
C77  C0402C102J5RACAUTO  [FP-C0402-BB-MFG]
DS1  TLMS1100-GS08  [VISH-TLMX1100_V]
DS2  TLMS1100-GS08  [VISH-TLMX1100_V]
DS3  TLMS1100-GS08  [VISH-TLMX1100_V]
R34  ERJ-2RKF1501X  [FP-ERJ2RK-IPC_A]
R35  ERJ-2RKF1501X  [FP-ERJ2RK-IPC_A]
R36  ERJ-2RKF1501X  [FP-ERJ2RK-IPC_A]
R37  ERJ-2RKF1501X  [FP-ERJ2RK-IPC_A]
R38  ERJ-2RKF1501X  [FP-ERJ2RK-IPC_A]
R39  ERJ-2RKF1501X  [FP-ERJ2RK-IPC_A]
R40  ERJ-2RKF1501X  [FP-ERJ2RK-IPC_A]
R41  ERJ-2RKF1501X  [FP-ERJ2RK-IPC_A]
R49  ERJ-2RKF1003X  [FP-ERJ2RK-IPC_C]
R50  ERJ-2RKF1003X  [FP-ERJ2RK-IPC_C]
R51  ERJ2RKF1002X  [RESC1005X40X25LL05T05]
R52  ERJ2RKF2200X  [RESC1005X40X25LL05T05]
R53  ERJ2RKF2200X  [RESC1005X40X25LL05T05]
R54  ERJ2RKF2200X  [RESC1005X40X25LL05T05]
R55  ERJ-2RKF1001X  [RESC1005X40X25NL05T05]
R56  ERJ-2RKF1001X  [RESC1005X40X25NL05T05]
R57  ERJ-2RKF1001X  [RESC1005X40X25NL05T05]

### Nets
GND: C77.2 R55.1 R56.1 R57.1
VDD_MCU: R34.2 R35.2 R36.2 R37.2 R38.2 R39.2 R40.2 R41.2 R49.2 R50.2
I2C1_SCL: R34.1 ; off-sheet I2C1_SCL
I2C1_SDA: R35.1 ; off-sheet I2C1_SDA
I2C2_SCL: R38.1 ; off-sheet I2C2_SCL
I2C2_SDA: R39.1 ; off-sheet I2C2_SDA
I2C3_SCL: R36.1 ; off-sheet I2C3_SCL
I2C3_SDA: R37.1 ; off-sheet I2C3_SDA
I2C4_SCL: R40.1 ; off-sheet I2C4_SCL
I2C4_SDA: R41.1 ; off-sheet I2C4_SDA
LED_BLUE: DS3.1(A) ; off-sheet LED_BLUE
LED_GREEN: DS2.1(A) ; off-sheet LED_GREEN
LED_RED: DS1.1(A) ; off-sheet LED_RED
nVDD_5V_HIPOWER_OC: R49.1 ; off-sheet nVDD_5V_HIPOWER_OC
nVDD_5V_PERIPH_OC: R50.1 ; off-sheet nVDD_5V_PERIPH_OC
PPM_INPUT: R52.2 ; off-sheet PPM_INPUT
PPM_INPUT_PORT: R52.1 R53.2 ; off-sheet PPM_INPUT_PORT
RSSI_IN: R51.2 ; off-sheet RSSI_IN
RSSI_IN_PORT: C77.1 R51.1 ; off-sheet RSSI_IN_PORT
USART6_TX_RC_IN: R54.2 ; off-sheet USART6_TX_RC_IN
USART6_TX_RC_IN_PORT: R53.1 R54.1 ; off-sheet USART6_TX_RC_IN_PORT
NetDS1_2: DS1.2(K) R55.2
NetDS2_2: DS2.2(K) R56.2
NetDS3_2: DS3.2(K) R57.2

### Notes on the sheet
- I2C BUSSES
- (near R51) RSSI_IN
- LEDs
- PPM IN / USART6_TX
- HIPOWER / PERIPH
- THIS DOCUMENT AND THE DATA DISCLOSED HEREIN OR
- HEREWITH IS THE PROPERTY OF ALTIUM LIMITED AND MAY
- DWG NO:
- REVISION
- REV:
- DESCRIPTION
- DATE
- APPROVED
- BE FREELY DISTRIBUTED IN WHOLE. NO RIGHTS ARE
- RESERVED OR EXPRESS OR IMPLIED WARANTEE GIVEN.
- ENG:
- APPROVALS
- PROJECT
- DSN:
- CHK:
- REFERENCE DOCUMENTS
- PROJECT REVISION:
- TITLE
- DOCUMENT REVISION:
- DESIGN ITEM:
- BOM:
- FAB DWG:
- PCB DWG:
- ASSY DWG:
- SCALE:
- A3
- SIZE
- CAGE CODE
- FILE NAME
- DWG NO.
- SHEET
- OF
- REV

### Library data of the parts
C77 = CMP-03020-024111-1: C0402 1,000 pF X7R 5.00% 50 V; Manufacturer: Kemet; Voltage Rating: 50 V; Temperature Coefficient: 15%; Tolerance: 0.05; Material: Ceramic; Lead Free: Yes; Value: 1,000 pF; Package: C0402-BB; Automotive: No; ComponentLink2Description: Datasheet; Ipc Land Pattern Name: CAPC10050X50; Octopart: https://octopart.com/c0402c102j5racauto-kemet-81882731; Device Class L2: Capacitors; Capacitance: 1,000 pF; Temperature Characteristic: X7R; Category: Cap; RoHS: TRUE; Temperature Range High: +125°C; ComponentLink2URL: https://content.kemet.com/datasheets/KEM_C1002_X7R_SMD.pdf; Temperature: -55°C to +125°C; Temperature Range Low: -55°C; Device Class L3: Ceramic Capacitors; Device Class L1: Passive Components; Manufacturer Part Number: C0402C102J5RACAUTO; Height: 0.55mm
DS1-DS3 = CMP-1666-00027-1: LED, RED, 2.1 V, -40 to 100 degC, 2-Pin SMD (0603), RoHS, Tape and Reel; Type (Capacitors): C0G; Resistance: 100000000000 Ohm; Capacitance: 12 pF; Voltage Rating: 50 V; Tolerance: 5%; Min Operating Temperature: -55degC; REACH SVHC: No SVHC; ComponentLink2Description: Datasheet; ComponentLink1URL: http://www.vishay.com/; Width: 0.8 mm; Package Quantity: 4000; PackageReference: TLMX1100; ComponentLink2URL: http://www.vishay.com/docs/83173/tlmb1100.pdf; Case/Package: 0603; Case Code (Metric): 1608; Packaging: Tape and Reel; Pins: 2; ComponentLink1Description: Manufacturer URL; Max Operating Temperature: 125degC; Height: 0.8 mm; Length: 1.6 mm; Mount: Surface Mount; PackageDescription: 2-Pin Surface Mount Device, Body 1.6 x 0.8 mm; DatasheetVersion: Rev. 2.7, 03/2016; Case Code (Imperial): 0603; Voltage Rating (DC): 50 V; RoHSCompliant: True; Radiation Hardening: No
R34-R41 = CMP-2002-00693-2: RES SMD 1.5K OHM 1% 1/10W 0402; Voltage Rating (DC): 50V; Temperature Coefficient: 100ppm/°C; Power Rating: 100mW; Resistance: 1.5kR; Features: Automotive AEC-Q200; Termination: SMD/SMT; Size Code: 0402; Mount: Surface Mount; Min Operating Temperature: -55°C; Construction: Rectangular; Case Code (Metric): 1005; Depth: 0.5mm; Max Operating Temperature: 155°C; RoHS Compliant: Yes; Packaging: Tape and Reel; Number of Pins: 2; Military Standard: Not; Package Quantity: 1; Height: 0.35mm; Resistor Type: Thick Film; Radiation Hardening: No; Length: 1mm; Case Code (Imperial): 0402; Tolerance: 1%; Voltage Rating: 50V; Resistance Tolerance: 1%; Contact Plating: Tin; Case/Package: 0402; REACH SVHC: No SVHC; Max Power Dissipation: 100mW; Series: ERJ; Technology: THICK FILM; Number of Terminations: 2; Width: 0.02inch; Lead Free: Lead Free
R49 R50 = CMP-2002-00608-4: RES SMD 100K OHM 1% 1/10W 0402; Resistance: 100kR; Voltage Rating (DC): 50V; Power Rating: 100mW; Temperature Coefficient: 100ppm/°C; Case/Package: 0402; Length: 1mm; Package Quantity: 1; Radiation Hardening: No; Case Code (Metric): 1005; Contact Plating: Tin; Mount: Surface Mount; Depth: 0.5mm; Max Operating Temperature: 155°C; Lead Free: Lead Free; Width: 0.5mm; Composition: Thick Film; Case Code (Imperial): 0402; Tolerance: 1%; Termination: SMD/SMT; Number of Pins: 2; Height: 0.35mm; Voltage Rating: 50V; Military Standard: Not; REACH SVHC: No SVHC; Packaging: Tape and Reel; Min Operating Temperature: -55°C; Max Power Dissipation: 100mW; Features: Automotive AEC-Q200; Number of Terminations: 2
R51 = CMP-2000-07588-1: as R18 on sheet S8_Usb_Select; RoHSCompliant: True; Lead Free: LeadFree; Package Quantity: 1; Contact Plating: Tin; Length: 1mm; Radiation Hardening: No; REACH SVHC: NoSVHC; Max Operating Temperature: 155degC; Depth: 0.5mm; Case Code (Imperial): 0402; Military Standard: Not; Package Description: 2-Pin Surface Mount Device, Body 1 x 0.5 mm; Termination: SMD/SMT; Case Code (Metric): 1005; Height: 0.35mm; Packaging: TapeandReel; Voltage Rating (DC): 50V; Package Reference: 402; Number of Pins: 2; Tolerance: 1%; Mounting Technology: SurfaceMount; Width: 0.02inch; Mount: SurfaceMount; Datasheet URL: https://industrial.panasonic.com/cdbs/www-data/pdf/RDA0000/AOA0000C304.pdf; Composition: ThickFilm; Datasheet Version: 02/2017; Manufacturer URL: http://www.panasonic.com/; Max Power Dissipation: 100mW; Number of Terminations: 2; Min Operating Temperature: -55degC
R52-R54 = CMP-2002-01131-1: Manufacturer: Panasonic; Part Number: ERJ2RKF2200X
R55-R57 = CMP-1011-00510-4: as R26 on sheet S10_Adc; PartNumber: ERJ-2RKF1001X; DatasheetVersion: 04/2015; Radiation Hardening: No; Pins: 2; Height: 0.35 mm; RoHSCompliant: true; Case Code (Imperial): 0402; ComponentLink2Description: Datasheet; ComponentLink1Description: Manufacturer URL; PackageReference: 0402; Mount: Surface Mount; Package Quantity: 10000; Tolerance: 1%; ComponentLink1URL: http://www.panasonic.com/; PackageDescription: 2-Pin Surface Mount Device, Body 1 x 0.5 mm; Mounting Technology: Surface Mount; Case Code (Metric): 1005; ComponentLink2URL: http://industrial.panasonic.com/cdbs/www-data/pdf/RDA0000/AOA0000C86.pdf; REACH SVHC: Yes; Packaging: Tape and Reel; Max Operating Temperature: 155 degC; Min Operating Temperature: -55 degC; Width: 0.5 mm; Length: 1 mm

## Sheet S12_Connectors.SchDoc
size 420 x 297 mm; SheetNumber: 12; SheetTotal: 11
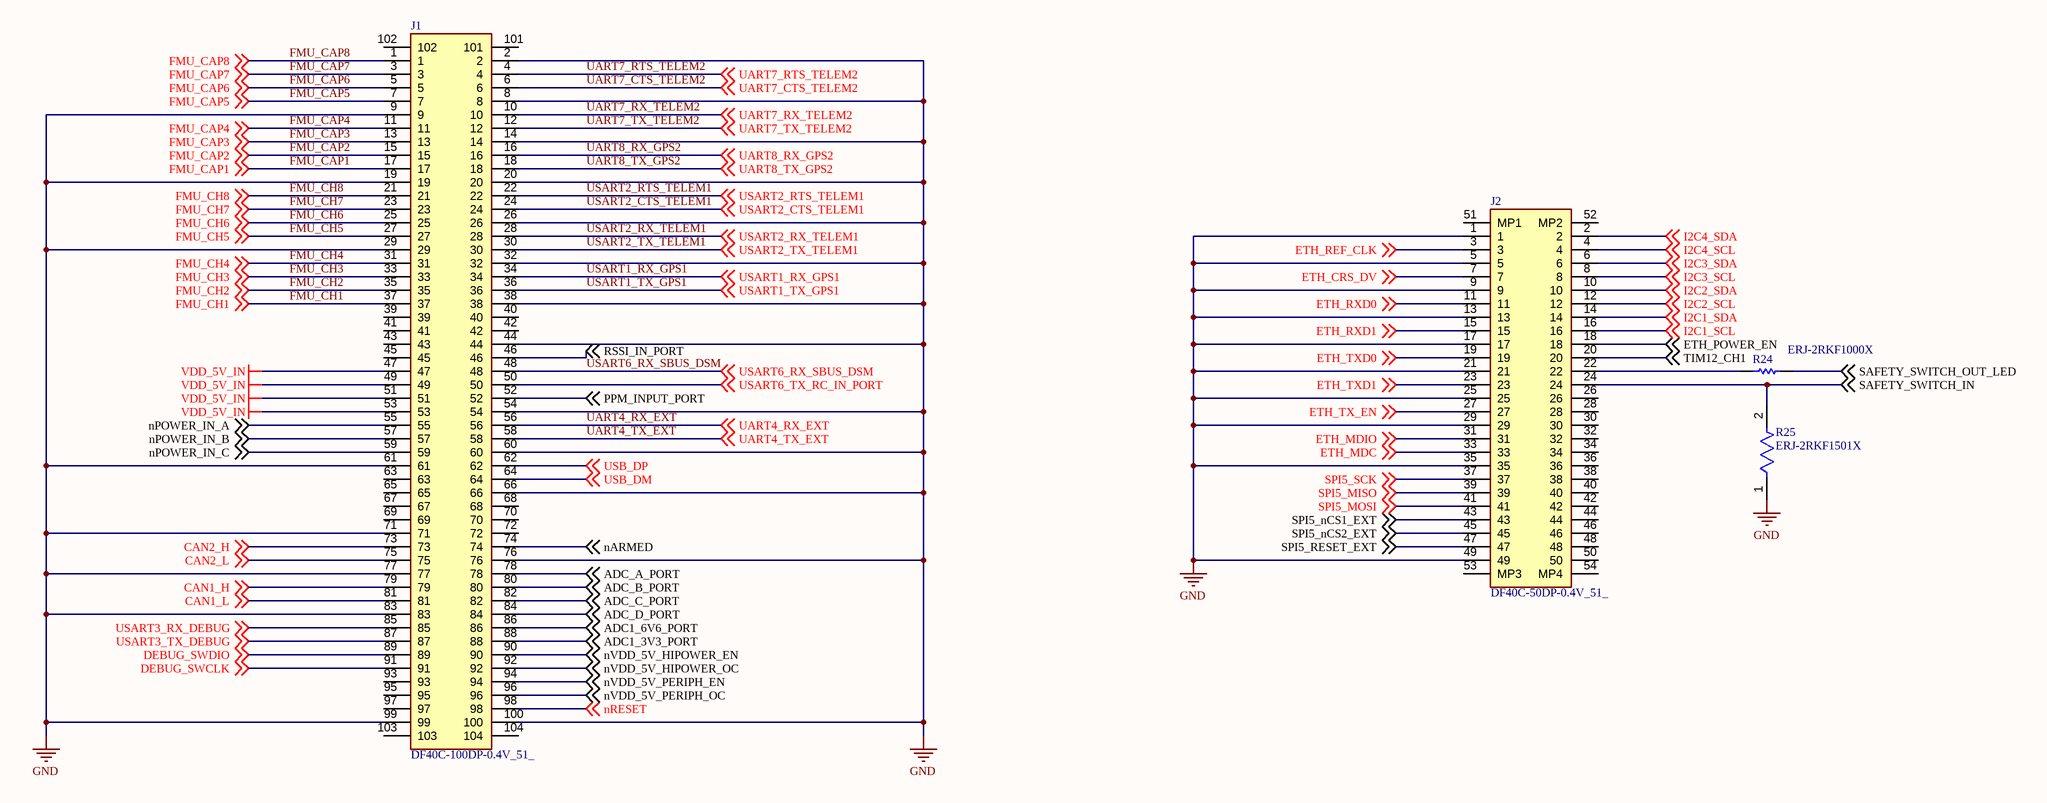
[diagram p11: S12_Connectors.SchDoc]

### Parts
J1  DF40C-100DP-0.4V_51_  [DF40C100DP04V51]
J2  DF40C-50DP-0.4V_51_  [DF40C50DP04V51]
R24  ERJ-2RKF1000X  [RESC1005X40X25LL05T05]
R25  ERJ-2RKF1501X  [FP-ERJ2RK-IPC_A]

### Nets
GND: J1.2 J1.8 J1.9 J1.14 J1.19 J1.20 J1.26 J1.29 J1.32 J1.38 J1.44 J1.54 J1.60 J1.61 J1.66 J1.71 J1.76 J1.77 J1.83 J1.99 J1.100 J2.1 J2.5 J2.9 J2.13 J2.17 J2.21 J2.25 J2.29 J2.35 J2.49 R25.1
VDD_5V_IN: J1.47 J1.49 J1.51 J1.53
ADC1_3V3_PORT: J1.88 ; off-sheet ADC1_3V3_PORT
ADC1_6V6_PORT: J1.86 ; off-sheet ADC1_6V6_PORT
ADC_A_PORT: J1.78 ; off-sheet ADC_A_PORT
ADC_B_PORT: J1.80 ; off-sheet ADC_B_PORT
ADC_C_PORT: J1.82 ; off-sheet ADC_C_PORT
ADC_D_PORT: J1.84 ; off-sheet ADC_D_PORT
CAN1_H: J1.79 ; off-sheet CAN1_H
CAN1_L: J1.81 ; off-sheet CAN1_L
CAN2_H: J1.73 ; off-sheet CAN2_H
CAN2_L: J1.75 ; off-sheet CAN2_L
DEBUG_SWCLK: J1.91 ; off-sheet DEBUG_SWCLK
DEBUG_SWDIO: J1.89 ; off-sheet DEBUG_SWDIO
ETH_CRS_DV: J2.7 ; off-sheet ETH_CRS_DV
ETH_MDC: J2.33 ; off-sheet ETH_MDC
ETH_MDIO: J2.31 ; off-sheet ETH_MDIO
ETH_POWER_EN: J2.18 ; off-sheet ETH_POWER_EN
ETH_REF_CLK: J2.3 ; off-sheet ETH_REF_CLK
ETH_RXD0: J2.11 ; off-sheet ETH_RXD0
ETH_RXD1: J2.15 ; off-sheet ETH_RXD1
ETH_TX_EN: J2.27 ; off-sheet ETH_TX_EN
ETH_TXD0: J2.19 ; off-sheet ETH_TXD0
ETH_TXD1: J2.23 ; off-sheet ETH_TXD1
FMU_CAP1: J1.17 ; off-sheet FMU_CAP1
FMU_CAP2: J1.15 ; off-sheet FMU_CAP2
FMU_CAP3: J1.13 ; off-sheet FMU_CAP3
FMU_CAP4: J1.11 ; off-sheet FMU_CAP4
FMU_CAP5: J1.7 ; off-sheet FMU_CAP5
FMU_CAP6: J1.5 ; off-sheet FMU_CAP6
FMU_CAP7: J1.3 ; off-sheet FMU_CAP7
FMU_CAP8: J1.1 ; off-sheet FMU_CAP8
FMU_CH1: J1.37 ; off-sheet FMU_CH1
FMU_CH2: J1.35 ; off-sheet FMU_CH2
FMU_CH3: J1.33 ; off-sheet FMU_CH3
FMU_CH4: J1.31 ; off-sheet FMU_CH4
FMU_CH5: J1.27 ; off-sheet FMU_CH5
FMU_CH6: J1.25 ; off-sheet FMU_CH6
FMU_CH7: J1.23 ; off-sheet FMU_CH7
FMU_CH8: J1.21 ; off-sheet FMU_CH8
I2C1_SCL: J2.16 ; off-sheet I2C1_SCL
I2C1_SDA: J2.14 ; off-sheet I2C1_SDA
I2C2_SCL: J2.12 ; off-sheet I2C2_SCL
I2C2_SDA: J2.10 ; off-sheet I2C2_SDA
I2C3_SCL: J2.8 ; off-sheet I2C3_SCL
I2C3_SDA: J2.6 ; off-sheet I2C3_SDA
I2C4_SCL: J2.4 ; off-sheet I2C4_SCL
I2C4_SDA: J2.2 ; off-sheet I2C4_SDA
nARMED: J1.74 ; off-sheet nARMED
nPOWER_IN_A: J1.55 ; off-sheet nPOWER_IN_A
nPOWER_IN_B: J1.57 ; off-sheet nPOWER_IN_B
nPOWER_IN_C: J1.59 ; off-sheet nPOWER_IN_C
nRESET: J1.98 ; off-sheet nRESET
nVDD_5V_HIPOWER_EN: J1.90 ; off-sheet nVDD_5V_HIPOWER_EN
nVDD_5V_HIPOWER_OC: J1.92 ; off-sheet nVDD_5V_HIPOWER_OC
nVDD_5V_PERIPH_EN: J1.94 ; off-sheet nVDD_5V_PERIPH_EN
nVDD_5V_PERIPH_OC: J1.96 ; off-sheet nVDD_5V_PERIPH_OC
PPM_INPUT_PORT: J1.52 ; off-sheet PPM_INPUT_PORT
RSSI_IN_PORT: J1.46 ; off-sheet RSSI_IN_PORT
SAFETY_SWITCH_IN: J2.24 R25.2 ; off-sheet SAFETY_SWITCH_IN
SAFETY_SWITCH_OUT_LED: R24.2 ; off-sheet SAFETY_SWITCH_OUT_LED
SPI5_MISO: J2.39 ; off-sheet SPI5_MISO
SPI5_MOSI: J2.41 ; off-sheet SPI5_MOSI
SPI5_nCS1_EXT: J2.43 ; off-sheet SPI5_nCS1_EXT
SPI5_nCS2_EXT: J2.45 ; off-sheet SPI5_nCS2_EXT
SPI5_RESET_EXT: J2.47 ; off-sheet SPI5_RESET_EXT
SPI5_SCK: J2.37 ; off-sheet SPI5_SCK
TIM12_CH1: J2.20 ; off-sheet TIM12_CH1
UART4_RX_EXT: J1.56 ; off-sheet UART4_RX_EXT
UART4_TX_EXT: J1.58 ; off-sheet UART4_TX_EXT
UART7_CTS_TELEM2: J1.6 ; off-sheet UART7_CTS_TELEM2
UART7_RTS_TELEM2: J1.4 ; off-sheet UART7_RTS_TELEM2
UART7_RX_TELEM2: J1.10 ; off-sheet UART7_RX_TELEM2
UART7_TX_TELEM2: J1.12 ; off-sheet UART7_TX_TELEM2
UART8_RX_GPS2: J1.16 ; off-sheet UART8_RX_GPS2
UART8_TX_GPS2: J1.18 ; off-sheet UART8_TX_GPS2
USART1_RX_GPS1: J1.34 ; off-sheet USART1_RX_GPS1
USART1_TX_GPS1: J1.36 ; off-sheet USART1_TX_GPS1
USART2_CTS_TELEM1: J1.24 ; off-sheet USART2_CTS_TELEM1
USART2_RTS_TELEM1: J1.22 ; off-sheet USART2_RTS_TELEM1
USART2_RX_TELEM1: J1.28 ; off-sheet USART2_RX_TELEM1
USART2_TX_TELEM1: J1.30 ; off-sheet USART2_TX_TELEM1
USART3_RX_DEBUG: J1.85 ; off-sheet USART3_RX_DEBUG
USART3_TX_DEBUG: J1.87 ; off-sheet USART3_TX_DEBUG
USART6_RX_SBUS_DSM: J1.48 ; off-sheet USART6_RX_SBUS_DSM
USART6_TX_RC_IN_PORT: J1.50 ; off-sheet USART6_TX_RC_IN_PORT
USB_DM: J1.64 ; off-sheet USB_DM
USB_DP: J1.62 ; off-sheet USB_DP
NetJ2_22: J2.22 R24.1

Not connected (* = marked no-connect by the designer): J1 39 40 41 42 43 45 63 65 67 68 69 70 72 93 95 97 101 102 103 104; J2 26 28 30 32 34 36 38 40 42 44 46 48 50 51(MP1) 52(MP2) 53(MP3) 54(MP4)

### Notes on the sheet
- THIS DOCUMENT AND THE DATA DISCLOSED HEREIN OR
- HEREWITH IS THE PROPERTY OF ALTIUM LIMITED AND MAY
- DWG NO:
- REVISION
- REV:
- DESCRIPTION
- DATE
- APPROVED
- BE FREELY DISTRIBUTED IN WHOLE. NO RIGHTS ARE
- RESERVED OR EXPRESS OR IMPLIED WARANTEE GIVEN.
- ENG:
- APPROVALS
- PROJECT
- DSN:
- CHK:
- REFERENCE DOCUMENTS
- PROJECT REVISION:
- TITLE
- DOCUMENT REVISION:
- DESIGN ITEM:
- BOM:
- FAB DWG:
- PCB DWG:
- ASSY DWG:
- SCALE:
- A3
- SIZE
- CAGE CODE
- FILE NAME
- DWG NO.
- SHEET
- OF
- REV

### Library data of the parts
J1 = CMP-002-00076-1: HIROSE(HRS) - DF40C-100DP-0.4V(51) - CONN, STACKING, HEADER, 100POS, 2ROW; Geometry.Height: 1mm; Manufacturer_Part_Number: DF40C-100DP-0.4V(51); Design Item ID: DF40C-100DP-0.4V_51_; Source: DF40C-100DP-0.4V_51_.SchLib; Mouser Price/Stock: https://www.mouser.co.uk/ProductDetail/Hirose-Connector/DF40C-100DP-0.4V51?qs=eDUdFcBPps2TxbrE27%2Ff2A%3D%3D; Mouser Part Number: 798-DF40C100DP0.4V51; Datasheet Link: https://datasheet.datasheetarchive.com/originals/distributors/SFDatasheet-7/sf-000141247.pdf; Manufacturer_Name: Hirose
J2 = CMP-007-000001-1: HIROSE(HRS) - DF40C-50DP-0.4V(51) - STIFTLEISTE, STAPELBAR, 50POS., 2 REIHEN; Geometry.Height: 1.29mm; Mouser Part Number: 798-DF40C50DP0.4V51; Manufacturer_Name: Hirose; Datasheet Link: https://www.hirose.com/en/product/document?clcode=CL0684-4014-0-51&productname=DF40C-50DP-0.4V(51)&series=DF40&documenttype=2DDrawing&lang=en&documentid=0001001212; Manufacturer_Part_Number: DF40C-50DP-0.4V(51); Mouser Price/Stock: https://www.mouser.co.uk/ProductDetail/Hirose-Connector/DF40C-50DP-0.4V51?qs=eDUdFcBPps0UZyNZPNBu5A%3D%3D; Design Item ID: DF40C-50DP-0.4V_51_; Source: DF40C-50DP-0.4V_51_.SchLib
R24 = CMP-2002-00605-3: Chip Resistor, 100 Ohm, +/- 1%, 100 mW, -55 to 155 degC, 0402 (1005 Metric), RoHS, Tape and Reel; Manufacturer: Basic Passives; Power Rating: 100 mW; Resistance: 100 Ohm; Voltage Rating: 50 V; Case\/Package: 0402; Width: 0.5 mm; Pins: 2; ComponentLink2Description: Datasheet; PackageReference: 0402; Height: 0.35 mm; Tolerance: 1%; DatasheetVersion: 04/2015; Case Code (Imperial): 0402; Min Operating Temperature: -55 degC; Radiation Hardening: No; Length: 1 mm; Package Quantity: 10000; PackageDescription: 2-Pin Surface Mount Device, Body 1 x 0.5 mm; Mounting Technology: Surface Mount; Case Code (Metric): 1005; Packaging: Tape and Reel; ComponentLink1URL: http://www.panasonic.com/; RoHSCompliant: true; Max Operating Temperature: 155 degC; REACH SVHC: Yes; PartNumber: ERJ-2RKF1000X; ComponentLink1Description: Manufacturer URL; ComponentLink2URL: http://industrial.panasonic.com/cdbs/www-data/pdf/RDA0000/AOA0000C86.pdf; Mount: Surface Mount
R25 = CMP-2002-00693-2: as R34 on sheet S11_Busses; Features: Automotive AEC-Q200; Termination: SMD/SMT; Size Code: 0402; Mount: Surface Mount; Min Operating Temperature: -55°C; Construction: Rectangular; Case Code (Metric): 1005; Depth: 0.5mm; Max Operating Temperature: 155°C; RoHS Compliant: Yes; Packaging: Tape and Reel; Number of Pins: 2; Military Standard: Not; Package Quantity: 1; Height: 0.35mm; Resistor Type: Thick Film; Radiation Hardening: No; Length: 1mm; Case Code (Imperial): 0402; Tolerance: 1%; Voltage Rating: 50V; Resistance Tolerance: 1%; Contact Plating: Tin; Case/Package: 0402; REACH SVHC: No SVHC; Max Power Dissipation: 100mW; Series: ERJ; Technology: THICK FILM; Number of Terminations: 2; Width: 0.02inch; Lead Free: Lead Free

## Nets that join several sheets
GND: S1_MCU (73 pins), S2_Power (24 pins), S3_Imu (18 pins), S5_Memory_Ram (7 pins), S4_Baro_Mag (13 pins), S6_Pwm (10 pins), S7_Uart (12 pins), S8_Usb_Select (18 pins), S9_Can (6 pins), S10_Adc (11 pins), S11_Busses (C77.2 R55.1 R56.1 R57.1), S12_Connectors (32 pins)
IO_3V3_A: S2_Power (C31.2 IC2.8), S6_Pwm (IC3.1 IC3.2 IC4.1 IC4.2), S7_Uart (9 pins)
IO_3V3_B: S2_Power (C32.2 C33.1 IC2.7), S6_Pwm (IC3.23 IC3.24 IC4.23 IC4.24), S7_Uart (6 pins)
VDD_5V_IN: S2_Power (12 pins), S9_Can (C65.1 C66.1 IC12.3 IC13.3), S10_Adc (R42.2), S12_Connectors (J1.47 J1.49 J1.51 J1.53)
VDD_MCU: S1_MCU (36 pins), S2_Power (7 pins), S5_Memory_Ram (6 pins), S8_Usb_Select (14 pins), S9_Can (IC12.5 IC13.5 R19.2 R21.2), S11_Busses (10 pins)
VDD_SENSOR: S2_Power (5 pins), S3_Imu (13 pins), S5_Memory_Ram (8 pins), S4_Baro_Mag (10 pins), S10_Adc (R44.2)
ADC1_3V3_PORT: S10_Adc (R48.2), S12_Connectors (J1.88)
ADC1_6V6_PORT: S10_Adc (R46.2), S12_Connectors (J1.86)
ADC_3V3: S1_MCU (MCU1_.U3), S10_Adc (C76.2 R48.1)
ADC_6V6: S1_MCU (MCU1_.R3), S10_Adc (C75.2 R46.1 R47.2)
ADC_A: S1_MCU (MCU1_.J5), S10_Adc (R26.1)
ADC_A_PORT: S10_Adc (C69.1 R26.2), S12_Connectors (J1.78)
ADC_B: S1_MCU (MCU1_.L3), S10_Adc (R27.1)
ADC_B_PORT: S10_Adc (C70.1 R27.2), S12_Connectors (J1.80)
ADC_C: S1_MCU (MCU1_.T7), S10_Adc (R30.1)
ADC_C_PORT: S10_Adc (C71.1 R30.2), S12_Connectors (J1.82)
ADC_D: S1_MCU (MCU1_.R7), S10_Adc (R31.1)
ADC_D_PORT: S10_Adc (C72.1 R31.2), S12_Connectors (J1.84)
CAN1_H: S9_Can (IC12.7 R20.1), S12_Connectors (J1.79)
CAN1_L: S9_Can (IC12.6 R20.2), S12_Connectors (J1.81)
CAN2_H: S9_Can (IC13.7 R22.1), S12_Connectors (J1.73)
CAN2_L: S9_Can (IC13.6 R22.2), S12_Connectors (J1.75)
DEBUG_SWCLK: S1_MCU (MCU1_.B14), S12_Connectors (J1.91)
DEBUG_SWDIO: S1_MCU (MCU1_.C15), S12_Connectors (J1.89)
ETH_CRS_DV: S1_MCU (MCU1_.R5), S12_Connectors (J2.7)
ETH_MDC: S1_MCU (MCU1_.M2), S12_Connectors (J2.33)
ETH_MDIO: S1_MCU (MCU1_.N3), S12_Connectors (J2.31)
ETH_POWER_EN: S1_MCU (MCU1_.E15), S12_Connectors (J2.18)
ETH_REF_CLK: S1_MCU (MCU1_.N4), S12_Connectors (J2.3)
ETH_RXD0: S1_MCU (MCU1_.T4), S12_Connectors (J2.11)
ETH_RXD1: S1_MCU (MCU1_.U4), S12_Connectors (J2.15)
ETH_TX_EN: S1_MCU (MCU1_.B9), S12_Connectors (J2.27)
ETH_TXD0: S1_MCU (MCU1_.D9), S12_Connectors (J2.19)
ETH_TXD1: S1_MCU (MCU1_.C9), S12_Connectors (J2.23)
FDCAN1_RX: S1_MCU (MCU1_.D13), S9_Can (IC12.4)
FDCAN1_TX: S1_MCU (MCU1_.E12), S9_Can (IC12.1)
FDCAN2_RX: S8_Usb_Select (IC11.7), S9_Can (IC13.4)
FDCAN2_TX: S8_Usb_Select (IC11.6), S9_Can (IC13.1)
FMU_CAP1: S6_Pwm (IC4.14), S12_Connectors (J1.17)
FMU_CAP2: S6_Pwm (IC4.15), S12_Connectors (J1.15)
FMU_CAP3: S6_Pwm (IC4.16), S12_Connectors (J1.13)
FMU_CAP4: S6_Pwm (IC4.17), S12_Connectors (J1.11)
FMU_CAP5: S6_Pwm (IC4.18), S12_Connectors (J1.7)
FMU_CAP6: S6_Pwm (IC4.19), S12_Connectors (J1.5)
FMU_CAP7: S6_Pwm (IC4.20), S12_Connectors (J1.3)
FMU_CAP8: S6_Pwm (IC4.21), S12_Connectors (J1.1)
FMU_CH1: S6_Pwm (IC3.14), S12_Connectors (J1.37)
FMU_CH2: S6_Pwm (IC3.15), S12_Connectors (J1.35)
FMU_CH3: S6_Pwm (IC3.16), S12_Connectors (J1.33)
FMU_CH4: S6_Pwm (IC3.17), S12_Connectors (J1.31)
FMU_CH5: S6_Pwm (IC3.18), S12_Connectors (J1.27)
FMU_CH6: S6_Pwm (IC3.19), S12_Connectors (J1.25)
FMU_CH7: S6_Pwm (IC3.20), S12_Connectors (J1.23)
FMU_CH8: S6_Pwm (IC3.21), S12_Connectors (J1.21)
HS_USB_EN: S1_MCU (MCU1_.R6), S8_Usb_Select (IC10.10 IC11.10 R18.1)
I2C1_DRDY_BMM350: S1_MCU (MCU1_.A4), S4_Baro_Mag (S5.A1)
I2C1_SCL: S1_MCU (MCU1_.B5), S11_Busses (R34.1), S12_Connectors (J2.16)
I2C1_SDA: S1_MCU (MCU1_.C5), S11_Busses (R35.1), S12_Connectors (J2.14)
I2C2_SCL: S1_MCU (MCU1_.G3), S11_Busses (R38.1), S12_Connectors (J2.12)
I2C2_SDA: S1_MCU (MCU1_.G4), S11_Busses (R39.1), S12_Connectors (J2.10)
I2C3_SCL: S1_MCU (MCU1_.U13), S4_Baro_Mag (S5.A3), S11_Busses (R36.1), S12_Connectors (J2.8)
I2C3_SDA: S1_MCU (MCU1_.T13), S4_Baro_Mag (S5.A2), S11_Busses (R37.1), S12_Connectors (J2.6)
I2C4_SCL: S1_MCU (MCU1_.P8), S11_Busses (R40.1), S12_Connectors (J2.4)
I2C4_SDA: S1_MCU (MCU1_.R9), S11_Busses (R41.1), S12_Connectors (J2.2)
LED_BLUE: S1_MCU (MCU1_.H16), S11_Busses (DS3.1)
LED_GREEN: S1_MCU (MCU1_.U8), S11_Busses (DS2.1)
LED_RED: S1_MCU (MCU1_.T8), S11_Busses (DS1.1)
nARMED: S1_MCU (MCU1_.D5), S12_Connectors (J1.74)
nPOWER_IN_A: S1_MCU (MCU1_.D4), S12_Connectors (J1.55)
nPOWER_IN_B: S1_MCU (MCU1_.T15), S12_Connectors (J1.57)
nPOWER_IN_C: S1_MCU (MCU1_.F14), S12_Connectors (J1.59)
nRESET: S1_MCU (MCU1_.K1), S2_Power (IC1.3 R1.1), S12_Connectors (J1.98)
nVDD_5V_HIPOWER_EN: S1_MCU (MCU1_.F13), S12_Connectors (J1.90)
nVDD_5V_HIPOWER_OC: S1_MCU (MCU1_.E3), S11_Busses (R49.1), S12_Connectors (J1.92)
nVDD_5V_PERIPH_EN: S1_MCU (MCU1_.T16), S12_Connectors (J1.94)
nVDD_5V_PERIPH_OC: S1_MCU (MCU1_.R15), S11_Busses (R50.1), S12_Connectors (J1.96)
nWP_EEPROM: S1_MCU (MCU1_.E4), S5_Memory_Ram (IC15.6)
OTG_HS_ULPI_CK: S1_MCU (MCU1_.T3), S8_Usb_Select (IC9.14)
OTG_HS_ULPI_D0: S1_MCU (MCU1_.U2), S8_Usb_Select (IC9.24)
OTG_HS_ULPI_D1: S1_MCU (MCU1_.U5), S8_Usb_Select (IC9.23)
OTG_HS_ULPI_D2: S1_MCU (MCU1_.T5), S8_Usb_Select (IC9.22)
OTG_HS_ULPI_D3: S1_MCU (MCU1_.P11), S8_Usb_Select (IC9.21)
OTG_HS_ULPI_D4: S1_MCU (MCU1_.P12), S8_Usb_Select (IC9.20)
OTG_HS_ULPI_D5/FDCAN2_RX: S1_MCU (MCU1_.T14), S8_Usb_Select (IC11.1)
OTG_HS_ULPI_D6/FDCAN2_TX: S1_MCU (MCU1_.U14), S8_Usb_Select (IC11.2)
OTG_HS_ULPI_D7: S1_MCU (MCU1_.A5), S8_Usb_Select (IC9.17)
OTG_HS_ULPI_DIR: S1_MCU (MCU1_.F4), S8_Usb_Select (IC9.12)
OTG_HS_ULPI_NXT: S1_MCU (MCU1_.M4), S8_Usb_Select (IC9.11)
OTG_HS_ULPI_STP: S1_MCU (MCU1_.L2), S8_Usb_Select (IC9.13)
PPM_INPUT: S1_MCU (MCU1_.P5), S11_Busses (R52.2)
PPM_INPUT_PORT: S11_Busses (R52.1 R53.2), S12_Connectors (J1.52)
RSSI_IN: S1_MCU (MCU1_.N2), S11_Busses (R51.2)
RSSI_IN_PORT: S11_Busses (C77.1 R51.1), S12_Connectors (J1.46)
SAFETY_SWITCH_IN: S1_MCU (MCU1_.D3), S12_Connectors (J2.24 R25.2)
SAFETY_SWITCH_OUT_LED: S1_MCU (MCU1_.D2), S12_Connectors (R24.2)
SCALED_VDD_3V3_SENS: S1_MCU (MCU1_.P2), S10_Adc (C74.2 R44.1 R45.2)
SCALED_VDD_5V_SENS: S1_MCU (MCU1_.P3), S10_Adc (C73.2 R42.1 R43.2)
SDMMC1_CARD_DETECT: S1_MCU (MCU1_.F3), S5_Memory_Ram (R15.2 SD0.9)
SDMMC1_CK: S1_MCU (MCU1_.C12), S5_Memory_Ram (SD0.5)
SDMMC1_CMD: S1_MCU (MCU1_.D12), S5_Memory_Ram (R12.2 SD0.3)
SDMMC1_D0: S1_MCU (MCU1_.E13), S5_Memory_Ram (R11.2 SD0.7)
SDMMC1_D1: S1_MCU (MCU1_.E14), S5_Memory_Ram (R10.2 SD0.8)
SDMMC1_D2: S1_MCU (MCU1_.A13), S5_Memory_Ram (R14.2 SD0.1)
SDMMC1_D3: S1_MCU (MCU1_.B13), S5_Memory_Ram (R13.2 SD0.2)
SPI1_DRDY_ICM45686: S1_MCU (MCU1_.P7), S3_Imu (S3.4)
SPI1_MISO: S1_MCU (MCU1_.B7), S3_Imu (S3.1)
SPI1_MOSI: S1_MCU (MCU1_.C11), S3_Imu (S3.14)
SPI1_nCS_ICM45686: S1_MCU (MCU1_.U9), S3_Imu (S3.12)
SPI1_SCK: S1_MCU (MCU1_.C6), S3_Imu (S3.13)
SPI2_DRDY_ICM42688P: S1_MCU (MCU1_.H15), S3_Imu (S1.4)
SPI2_MISO: S1_MCU (MCU1_.M3), S3_Imu (S1.1)
SPI2_MOSI: S1_MCU (MCU1_.C14), S3_Imu (S1.14)
SPI2_nCS_ICM42688P: S1_MCU (MCU1_.T9), S3_Imu (S1.12)
SPI2_SCK: S1_MCU (MCU1_.A15), S3_Imu (S1.13)
SPI4_DRDY_BMI088_ACCEL1: S1_MCU (MCU1_.H14), S3_Imu (S2.16)
SPI4_DRDY_BMI088_ACCEL2: S1_MCU (MCU1_.G14), S3_Imu (S2.1)
SPI4_DRDY_BMI088_GYRO1: S1_MCU (MCU1_.G15), S3_Imu (S2.12)
SPI4_DRDY_BMI088_GYRO2: S1_MCU (MCU1_.F16), S3_Imu (S2.13)
SPI4_DRDY_ICP20100: S1_MCU (MCU1_.F15), S4_Baro_Mag (S6.7)
SPI4_MISO: S1_MCU (MCU1_.D1), S3_Imu (S2.10 S2.15), S4_Baro_Mag (S6.6)
SPI4_MOSI: S1_MCU (MCU1_.E5), S3_Imu (S2.9), S4_Baro_Mag (S6.4)
SPI4_nCS_BMI088_ACCEL: S1_MCU (MCU1_.N9), S3_Imu (S2.14)
SPI4_nCS_BMI088_GYRO: S1_MCU (MCU1_.P10), S3_Imu (S2.5)
SPI4_nCS_ICP20100: S1_MCU (MCU1_.R10), S4_Baro_Mag (S6.1)
SPI4_SCK: S1_MCU (MCU1_.C3), S3_Imu (S2.8), S4_Baro_Mag (S6.2)
SPI5_MISO: S1_MCU (MCU1_.K4), S5_Memory_Ram (IC14.2 IC15.4), S4_Baro_Mag (S4.6), S12_Connectors (J2.39)
SPI5_MOSI: S1_MCU (MCU1_.L14), S5_Memory_Ram (IC14.5 IC15.7), S4_Baro_Mag (S4.7), S12_Connectors (J2.41)
SPI5_nCS1_EXT: S1_MCU (MCU1_.K3), S12_Connectors (J2.43)
SPI5_nCS2_EXT: S1_MCU (MCU1_.A9), S12_Connectors (J2.45)
SPI5_nCS_EEPROM: S1_MCU (MCU1_.E2), S5_Memory_Ram (IC15.2)
SPI5_nCS_FM25V10G: S1_MCU (MCU1_.R11), S5_Memory_Ram (IC14.1)
SPI5_nCS_MS5611: S1_MCU (MCU1_.T10), S4_Baro_Mag (S4.4 S4.5)
SPI5_RESET_EXT: S1_MCU (MCU1_.B16), S12_Connectors (J2.47)
SPI5_SCK: S1_MCU (MCU1_.J14), S5_Memory_Ram (IC14.6 IC15.5), S4_Baro_Mag (S4.8), S12_Connectors (J2.37)
TIM1_CH1: S1_MCU (MCU1_.J15), S6_Pwm (IC3.10)
TIM1_CH2: S1_MCU (MCU1_.K14), S6_Pwm (IC3.9)
TIM1_CH3: S1_MCU (MCU1_.M14), S6_Pwm (IC3.8)
TIM1_CH4: S1_MCU (MCU1_.U10), S6_Pwm (IC3.7)
TIM4_CH1: S1_MCU (MCU1_.R16), S6_Pwm (IC4.10)
TIM4_CH2: S1_MCU (MCU1_.R17), S6_Pwm (IC4.9)
TIM4_CH3: S1_MCU (MCU1_.P16), S6_Pwm (IC4.8)
TIM4_CH4: S1_MCU (MCU1_.P15), S6_Pwm (IC4.7)
TIM5_CH1: S1_MCU (MCU1_.N5), S6_Pwm (IC4.6)
TIM5_CH2: S1_MCU (MCU1_.P14), S6_Pwm (IC4.5)
TIM5_CH3: S1_MCU (MCU1_.R14), S6_Pwm (IC4.4)
TIM5_CH4: S1_MCU (MCU1_.A16), S6_Pwm (IC4.3)
TIM8_CH1: S1_MCU (MCU1_.A3), S6_Pwm (IC3.6)
TIM8_CH2: S1_MCU (MCU1_.A2), S6_Pwm (IC3.5)
TIM8_CH3: S1_MCU (MCU1_.B3), S6_Pwm (IC3.4)
TIM8_CH4: S1_MCU (MCU1_.B15), S6_Pwm (IC3.3)
TIM12_CH1: S1_MCU (MCU1_.T11), S12_Connectors (J2.20)
UART4_RX: S1_MCU (MCU1_.B17), S7_Uart (IC7.1)
UART4_RX_EXT: S7_Uart (IC7.20), S12_Connectors (J1.56)
UART4_TX: S1_MCU (MCU1_.D16), S7_Uart (IC7.3)
UART4_TX_EXT: S7_Uart (IC7.18), S12_Connectors (J1.58)
UART7_CTS: S1_MCU (MCU1_.L4), S7_Uart (IC5.3)
UART7_CTS_TELEM2: S7_Uart (IC5.18), S12_Connectors (J1.6)
UART7_RTS: S1_MCU (MCU1_.P9), S7_Uart (IC5.1)
UART7_RTS_TELEM2: S7_Uart (IC5.20), S12_Connectors (J1.4)
UART7_RX: S1_MCU (MCU1_.K2), S7_Uart (IC5.4)
UART7_RX_TELEM2: S7_Uart (IC5.17), S12_Connectors (J1.10)
UART7_TX: S1_MCU (MCU1_.A14), S7_Uart (IC5.5)
UART7_TX_TELEM2: S7_Uart (IC5.16), S12_Connectors (J1.12)
UART8_RX: S1_MCU (MCU1_.C4), S7_Uart (IC5.6)
UART8_RX_GPS2: S7_Uart (IC5.15), S12_Connectors (J1.16)
UART8_TX: S1_MCU (MCU1_.B4), S7_Uart (IC5.7)
UART8_TX_GPS2: S7_Uart (IC5.14), S12_Connectors (J1.18)
USART1_RX: S1_MCU (MCU1_.D14), S7_Uart (IC6.4)
USART1_RX_GPS1: S7_Uart (IC6.17), S12_Connectors (J1.34)
USART1_TX: S1_MCU (MCU1_.U15), S7_Uart (IC6.5)
USART1_TX_GPS1: S7_Uart (IC6.16), S12_Connectors (J1.36)
USART2_CTS: S1_MCU (MCU1_.B12), S7_Uart (IC5.9)
USART2_CTS_TELEM1: S7_Uart (IC5.12), S12_Connectors (J1.24)
USART2_RTS: S1_MCU (MCU1_.A12), S7_Uart (IC5.8)
USART2_RTS_TELEM1: S7_Uart (IC5.13), S12_Connectors (J1.22)
USART2_RX: S1_MCU (MCU1_.B11), S7_Uart (IC6.1)
USART2_RX_TELEM1: S7_Uart (IC6.20), S12_Connectors (J1.28)
USART2_TX: S1_MCU (MCU1_.A11), S7_Uart (IC6.3)
USART2_TX_TELEM1: S7_Uart (IC6.18), S12_Connectors (J1.30)
USART3_RX: S1_MCU (MCU1_.T17), S7_Uart (IC7.5)
USART3_RX_DEBUG: S7_Uart (IC7.17), S12_Connectors (J1.85)
USART3_TX: S1_MCU (MCU1_.U16), S7_Uart (IC7.4)
USART3_TX_DEBUG: S7_Uart (IC7.16), S12_Connectors (J1.87)
USART6_RX: S1_MCU (MCU1_.A10), S7_Uart (IC6.8)
USART6_RX_SBUS_DSM: S7_Uart (IC6.13), S12_Connectors (J1.48)
USART6_TX: S1_MCU (MCU1_.D8), S7_Uart (IC6.9)
USART6_TX_RC_IN: S7_Uart (IC6.12), S11_Busses (R54.2)
USART6_TX_RC_IN_PORT: S11_Busses (R53.1 R54.1), S12_Connectors (J1.50)
USB_DM: S8_Usb_Select (IC10.2), S12_Connectors (J1.64)
USB_DP: S8_Usb_Select (IC10.1), S12_Connectors (J1.62)
USB_OTG_FS_DM: S1_MCU (MCU1_.E17), S8_Usb_Select (IC10.6)
USB_OTG_FS_DP: S1_MCU (MCU1_.E16), S8_Usb_Select (IC10.7)
USB_OTG_FS_VBUS: S1_MCU (MCU1_.D15), S8_Usb_Select (IC9.4)
VDD_3V3_SENSORS_EN: S1_MCU (MCU1_.D6), S2_Power (IC8.4)